# EAGLE schematic RU-PCBA-2X2-001-03 (EAGLE 9.7.0), part 4 of 5
## Sheet 10 of 17: Row 10
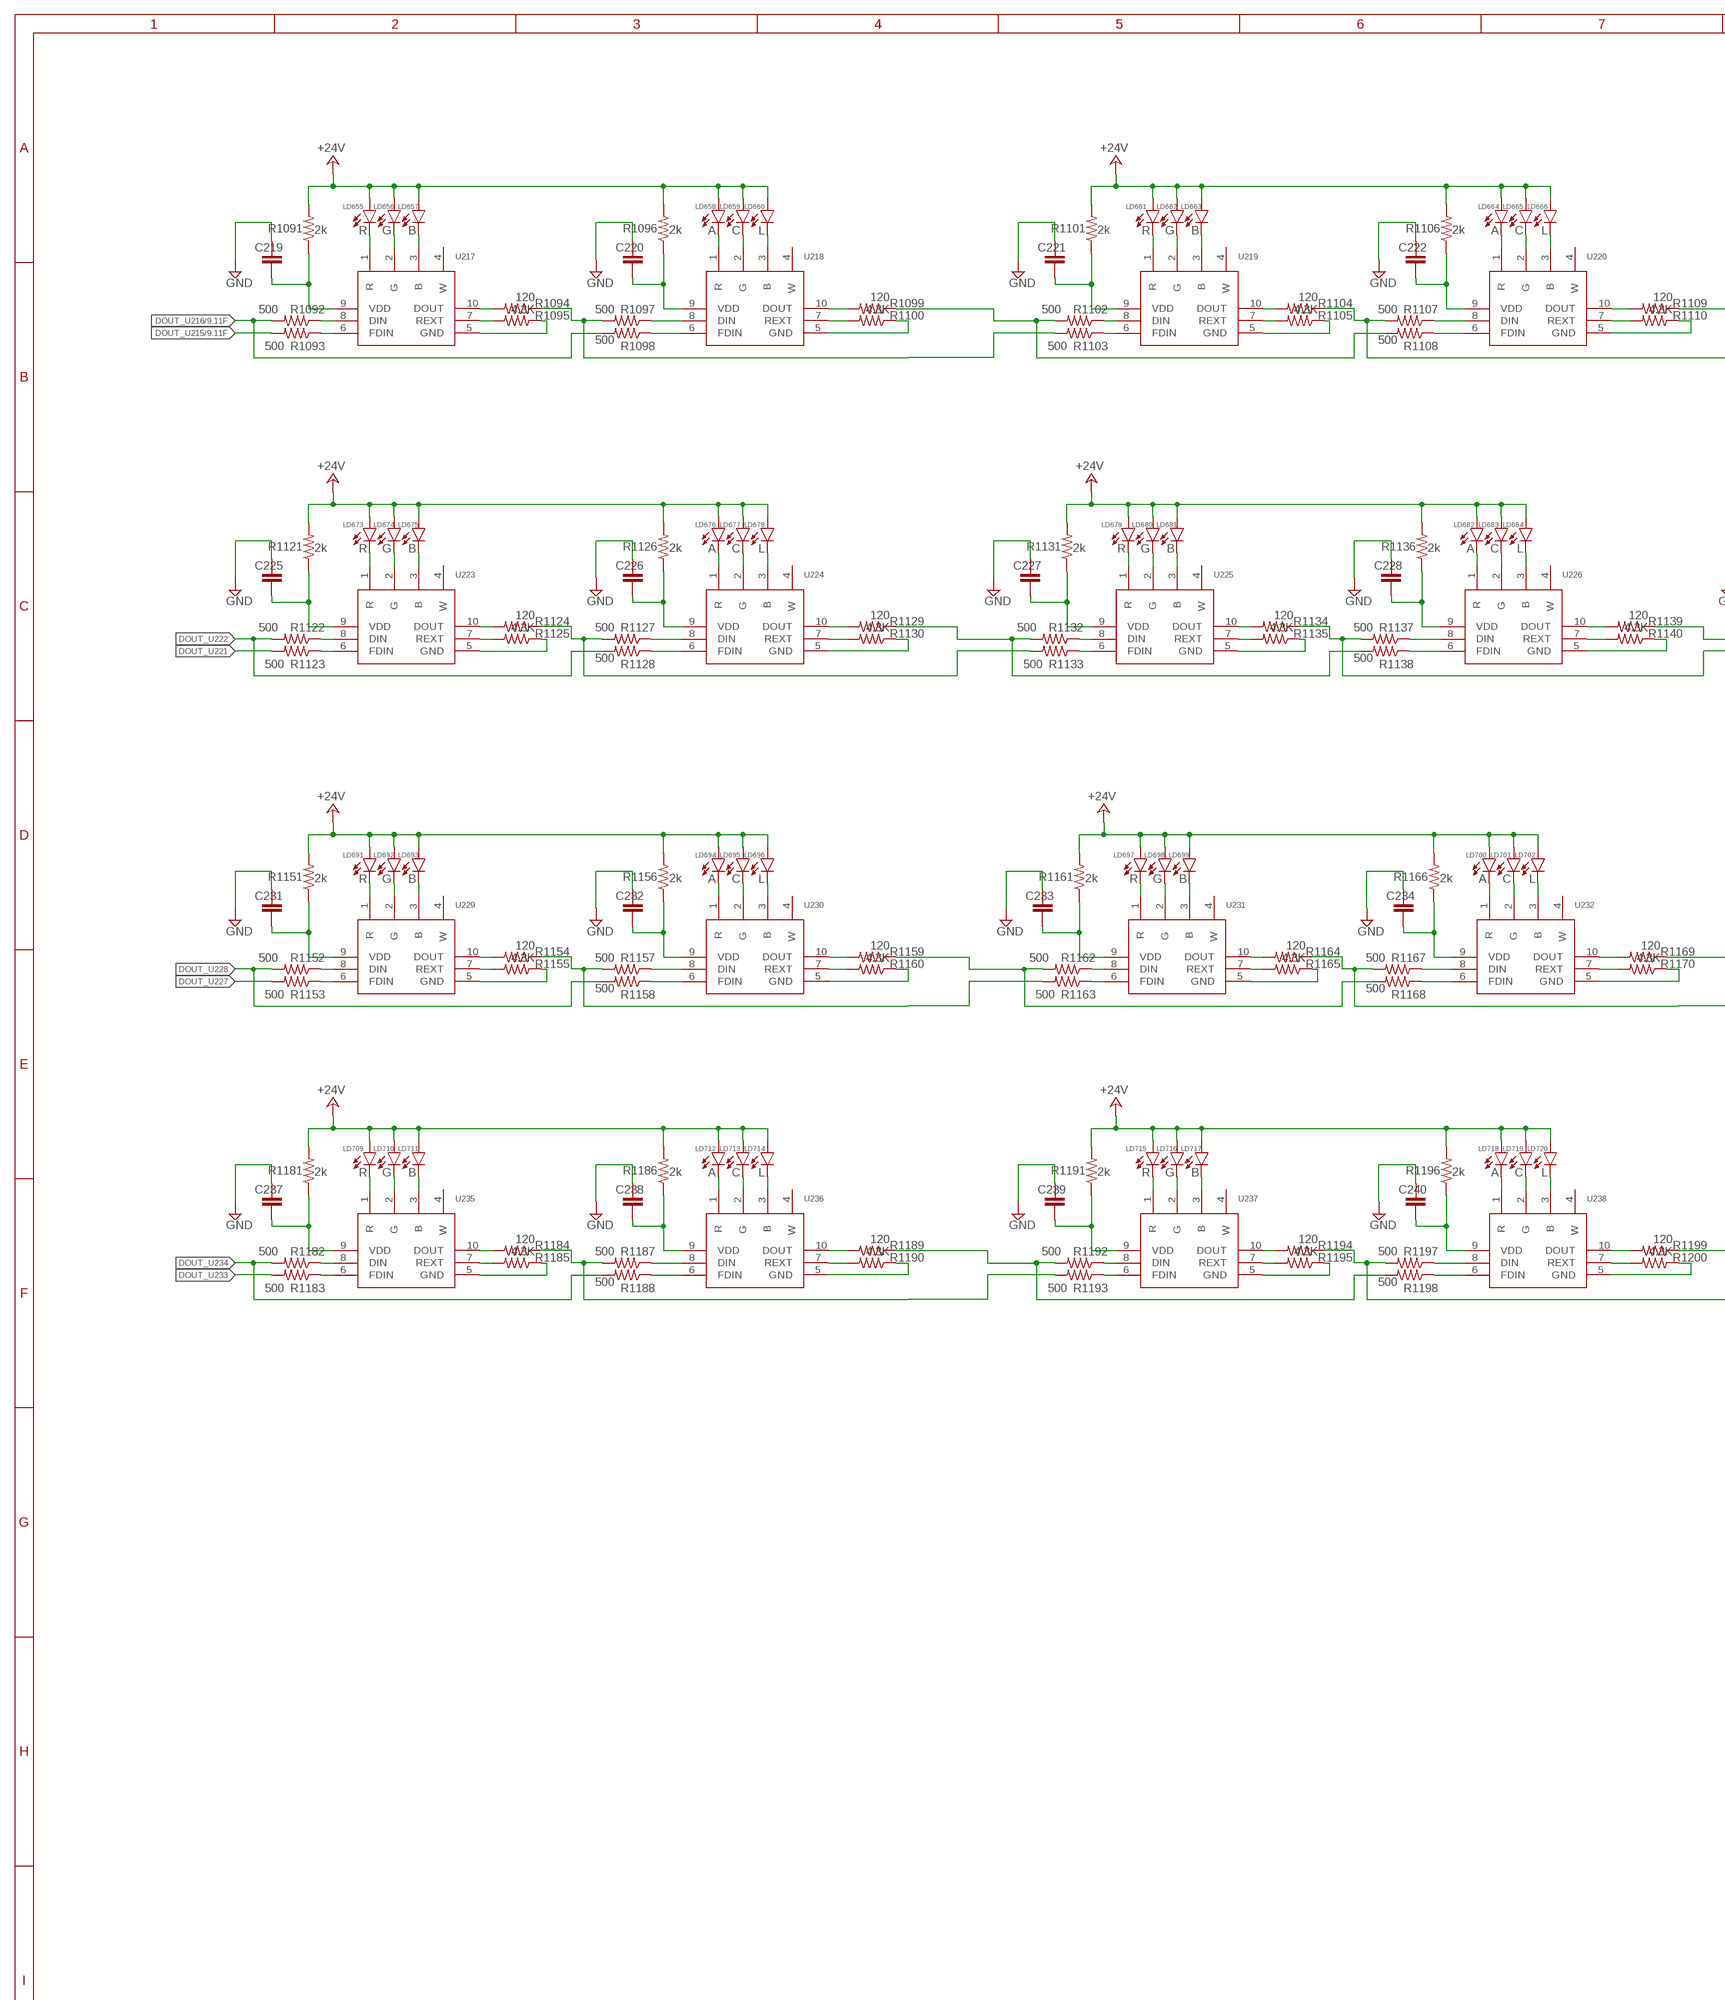
[diagram p18: schematic, sheet 10, part 1 of 2]
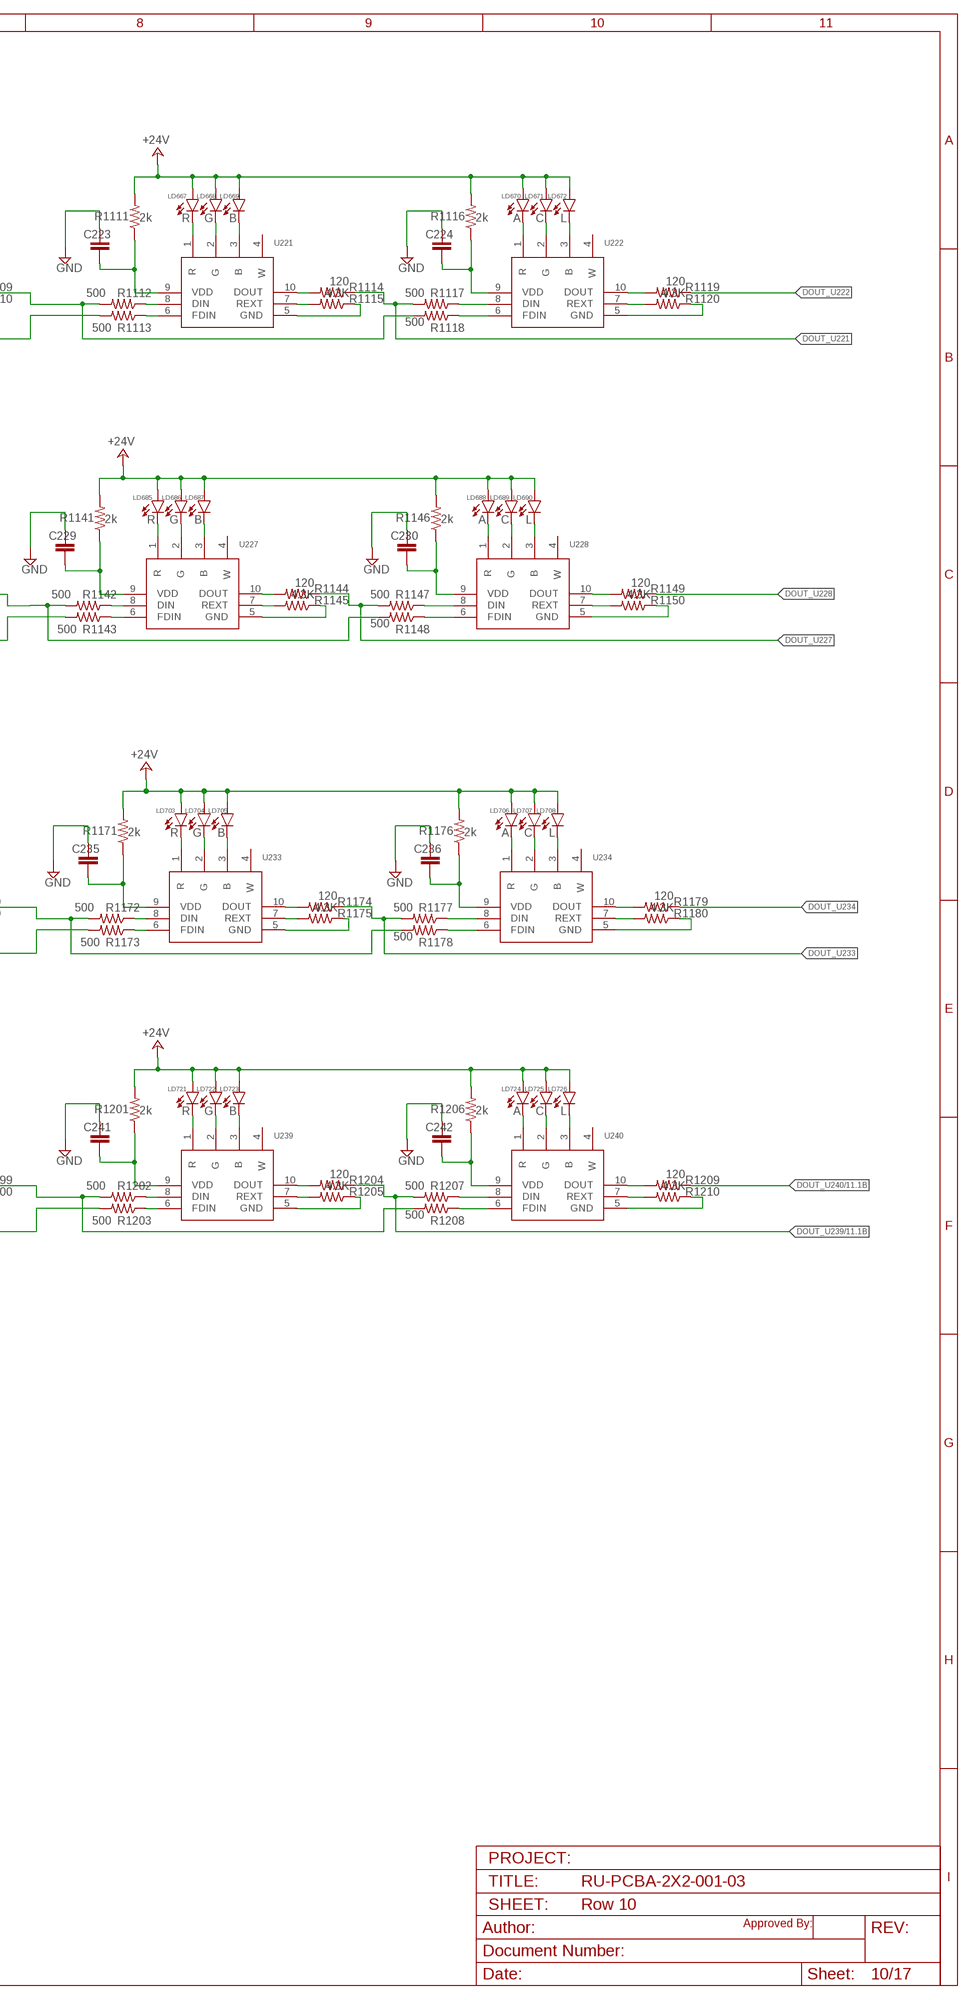
[diagram p19: schematic, sheet 10, part 2 of 2]

### Parts
C219  C-EUC1206  [C1206]
C220  C-EUC1206  [C1206]
C221  C-EUC1206  [C1206]
C222  C-EUC1206  [C1206]
C223  C-EUC1206  [C1206]
C224  C-EUC1206  [C1206]
C225  C-EUC1206  [C1206]
C226  C-EUC1206  [C1206]
C227  C-EUC1206  [C1206]
C228  C-EUC1206  [C1206]
C229  C-EUC1206  [C1206]
C230  C-EUC1206  [C1206]
C231  C-EUC1206  [C1206]
C232  C-EUC1206  [C1206]
C233  C-EUC1206  [C1206]
C234  C-EUC1206  [C1206]
C235  C-EUC1206  [C1206]
C236  C-EUC1206  [C1206]
C237  C-EUC1206  [C1206]
C238  C-EUC1206  [C1206]
C239  C-EUC1206  [C1206]
C240  C-EUC1206  [C1206]
C241  C-EUC1206  [C1206]
C242  C-EUC1206  [C1206]
LD655  R  5050LED  [5050LED]
LD656  G  5050LED  [5050LED]
LD657  B  5050LED  [5050LED]
LD658  A  5050LED  [5050LED]
LD659  C  5050LED  [5050LED]
LD660  L  5050LED  [5050LED]
LD661  R  5050LED  [5050LED]
LD662  G  5050LED  [5050LED]
LD663  B  5050LED  [5050LED]
LD664  A  5050LED  [5050LED]
LD665  C  5050LED  [5050LED]
LD666  L  5050LED  [5050LED]
LD667  R  5050LED  [5050LED]
LD668  G  5050LED  [5050LED]
LD669  B  5050LED  [5050LED]
LD670  A  5050LED  [5050LED]
LD671  C  5050LED  [5050LED]
LD672  L  5050LED  [5050LED]
LD673  R  5050LED  [5050LED]
LD674  G  5050LED  [5050LED]
LD675  B  5050LED  [5050LED]
LD676  A  5050LED  [5050LED]
LD677  C  5050LED  [5050LED]
LD678  L  5050LED  [5050LED]
LD679  R  5050LED  [5050LED]
LD680  G  5050LED  [5050LED]
LD681  B  5050LED  [5050LED]
LD682  A  5050LED  [5050LED]
LD683  C  5050LED  [5050LED]
LD684  L  5050LED  [5050LED]
LD685  R  5050LED  [5050LED]
LD686  G  5050LED  [5050LED]
LD687  B  5050LED  [5050LED]
LD688  A  5050LED  [5050LED]
LD689  C  5050LED  [5050LED]
LD690  L  5050LED  [5050LED]
LD691  R  5050LED  [5050LED]
LD692  G  5050LED  [5050LED]
LD693  B  5050LED  [5050LED]
LD694  A  5050LED  [5050LED]
LD695  C  5050LED  [5050LED]
LD696  L  5050LED  [5050LED]
LD697  R  5050LED  [5050LED]
LD698  G  5050LED  [5050LED]
LD699  B  5050LED  [5050LED]
LD700  A  5050LED  [5050LED]
LD701  C  5050LED  [5050LED]
LD702  L  5050LED  [5050LED]
LD703  R  5050LED  [5050LED]
LD704  G  5050LED  [5050LED]
LD705  B  5050LED  [5050LED]
LD706  A  5050LED  [5050LED]
LD707  C  5050LED  [5050LED]
LD708  L  5050LED  [5050LED]
LD709  R  5050LED  [5050LED]
LD710  G  5050LED  [5050LED]
LD711  B  5050LED  [5050LED]
LD712  A  5050LED  [5050LED]
LD713  C  5050LED  [5050LED]
LD714  L  5050LED  [5050LED]
LD715  R  5050LED  [5050LED]
LD716  G  5050LED  [5050LED]
LD717  B  5050LED  [5050LED]
LD718  A  5050LED  [5050LED]
LD719  C  5050LED  [5050LED]
LD720  L  5050LED  [5050LED]
LD721  R  5050LED  [5050LED]
LD722  G  5050LED  [5050LED]
LD723  B  5050LED  [5050LED]
LD724  A  5050LED  [5050LED]
LD725  C  5050LED  [5050LED]
LD726  L  5050LED  [5050LED]
R1091  2k  R-US_R1206  [R1206]
R1092  500  R-US_R0805  [R0805]
R1093  500  R-US_R0805  [R0805]
R1094  120  R-US_R0805  [R0805]
R1095  4.3K  R-US_R0805  [R0805]
R1096  2k  R-US_R1206  [R1206]
R1097  500  R-US_R0805  [R0805]
R1098  500  R-US_R0805  [R0805]
R1099  120  R-US_R0805  [R0805]
R1100  4.3K  R-US_R0805  [R0805]
R1101  2k  R-US_R1206  [R1206]
R1102  500  R-US_R0805  [R0805]
R1103  500  R-US_R0805  [R0805]
R1104  120  R-US_R0805  [R0805]
R1105  4.3K  R-US_R0805  [R0805]
R1106  2k  R-US_R1206  [R1206]
R1107  500  R-US_R0805  [R0805]
R1108  500  R-US_R0805  [R0805]
R1109  120  R-US_R0805  [R0805]
R1110  4.3K  R-US_R0805  [R0805]
R1111  2k  R-US_R1206  [R1206]
R1112  500  R-US_R0805  [R0805]
R1113  500  R-US_R0805  [R0805]
R1114  120  R-US_R0805  [R0805]
R1115  4.3K  R-US_R0805  [R0805]
R1116  2k  R-US_R1206  [R1206]
R1117  500  R-US_R0805  [R0805]
R1118  500  R-US_R0805  [R0805]
R1119  120  R-US_R0805  [R0805]
R1120  4.3K  R-US_R0805  [R0805]
R1121  2k  R-US_R1206  [R1206]
R1122  500  R-US_R0805  [R0805]
R1123  500  R-US_R0805  [R0805]
R1124  120  R-US_R0805  [R0805]
R1125  4.3K  R-US_R0805  [R0805]
R1126  2k  R-US_R1206  [R1206]
R1127  500  R-US_R0805  [R0805]
R1128  500  R-US_R0805  [R0805]
R1129  120  R-US_R0805  [R0805]
R1130  4.3K  R-US_R0805  [R0805]
R1131  2k  R-US_R1206  [R1206]
R1132  500  R-US_R0805  [R0805]
R1133  500  R-US_R0805  [R0805]
R1134  120  R-US_R0805  [R0805]
R1135  4.3K  R-US_R0805  [R0805]
R1136  2k  R-US_R1206  [R1206]
R1137  500  R-US_R0805  [R0805]
R1138  500  R-US_R0805  [R0805]
R1139  120  R-US_R0805  [R0805]
R1140  4.3K  R-US_R0805  [R0805]
R1141  2k  R-US_R1206  [R1206]
R1142  500  R-US_R0805  [R0805]
R1143  500  R-US_R0805  [R0805]
R1144  120  R-US_R0805  [R0805]
R1145  4.3K  R-US_R0805  [R0805]
R1146  2k  R-US_R1206  [R1206]
R1147  500  R-US_R0805  [R0805]
R1148  500  R-US_R0805  [R0805]
R1149  120  R-US_R0805  [R0805]
R1150  4.3K  R-US_R0805  [R0805]
R1151  2k  R-US_R1206  [R1206]
R1152  500  R-US_R0805  [R0805]
R1153  500  R-US_R0805  [R0805]
R1154  120  R-US_R0805  [R0805]
R1155  4.3K  R-US_R0805  [R0805]
R1156  2k  R-US_R1206  [R1206]
R1157  500  R-US_R0805  [R0805]
R1158  500  R-US_R0805  [R0805]
R1159  120  R-US_R0805  [R0805]
R1160  4.3K  R-US_R0805  [R0805]
R1161  2k  R-US_R1206  [R1206]
R1162  500  R-US_R0805  [R0805]
R1163  500  R-US_R0805  [R0805]
R1164  120  R-US_R0805  [R0805]
R1165  4.3K  R-US_R0805  [R0805]
R1166  2k  R-US_R1206  [R1206]
R1167  500  R-US_R0805  [R0805]
R1168  500  R-US_R0805  [R0805]
R1169  120  R-US_R0805  [R0805]
R1170  4.3K  R-US_R0805  [R0805]
R1171  2k  R-US_R1206  [R1206]
R1172  500  R-US_R0805  [R0805]
R1173  500  R-US_R0805  [R0805]
R1174  120  R-US_R0805  [R0805]
R1175  4.3K  R-US_R0805  [R0805]
R1176  2k  R-US_R1206  [R1206]
R1177  500  R-US_R0805  [R0805]
R1178  500  R-US_R0805  [R0805]
R1179  120  R-US_R0805  [R0805]
R1180  4.3K  R-US_R0805  [R0805]
R1181  2k  R-US_R1206  [R1206]
R1182  500  R-US_R0805  [R0805]
R1183  500  R-US_R0805  [R0805]
R1184  120  R-US_R0805  [R0805]
R1185  4.3K  R-US_R0805  [R0805]
R1186  2k  R-US_R1206  [R1206]
R1187  500  R-US_R0805  [R0805]
R1188  500  R-US_R0805  [R0805]
R1189  120  R-US_R0805  [R0805]
R1190  4.3K  R-US_R0805  [R0805]
R1191  2k  R-US_R1206  [R1206]
R1192  500  R-US_R0805  [R0805]
R1193  500  R-US_R0805  [R0805]
R1194  120  R-US_R0805  [R0805]
R1195  4.3K  R-US_R0805  [R0805]
R1196  2k  R-US_R1206  [R1206]
R1197  500  R-US_R0805  [R0805]
R1198  500  R-US_R0805  [R0805]
R1199  120  R-US_R0805  [R0805]
R1200  4.3K  R-US_R0805  [R0805]
R1201  2k  R-US_R1206  [R1206]
R1202  500  R-US_R0805  [R0805]
R1203  500  R-US_R0805  [R0805]
R1204  120  R-US_R0805  [R0805]
R1205  4.3K  R-US_R0805  [R0805]
R1206  2k  R-US_R1206  [R1206]
R1207  500  R-US_R0805  [R0805]
R1208  500  R-US_R0805  [R0805]
R1209  120  R-US_R0805  [R0805]
R1210  4.3K  R-US_R0805  [R0805]
U217  UCS7604  [SOP100P600X175-10N]
U218  UCS7604  [SOP100P600X175-10N]
U219  UCS7604  [SOP100P600X175-10N]
U220  UCS7604  [SOP100P600X175-10N]
U221  UCS7604  [SOP100P600X175-10N]
U222  UCS7604  [SOP100P600X175-10N]
U223  UCS7604  [SOP100P600X175-10N]
U224  UCS7604  [SOP100P600X175-10N]
U225  UCS7604  [SOP100P600X175-10N]
U226  UCS7604  [SOP100P600X175-10N]
U227  UCS7604  [SOP100P600X175-10N]
U228  UCS7604  [SOP100P600X175-10N]
U229  UCS7604  [SOP100P600X175-10N]
U230  UCS7604  [SOP100P600X175-10N]
U231  UCS7604  [SOP100P600X175-10N]
U232  UCS7604  [SOP100P600X175-10N]
U233  UCS7604  [SOP100P600X175-10N]
U234  UCS7604  [SOP100P600X175-10N]
U235  UCS7604  [SOP100P600X175-10N]
U236  UCS7604  [SOP100P600X175-10N]
U237  UCS7604  [SOP100P600X175-10N]
U238  UCS7604  [SOP100P600X175-10N]
U239  UCS7604  [SOP100P600X175-10N]
U240  UCS7604  [SOP100P600X175-10N]

### Nets
+24V: LD655.A LD656.A LD657.A LD658.A LD659.A LD660.A LD661.A LD662.A LD663.A LD664.A LD665.A LD666.A LD667.A LD668.A LD669.A LD670.A LD671.A LD672.A LD673.A LD674.A LD675.A LD676.A LD677.A LD678.A LD679.A LD680.A LD681.A LD682.A LD683.A LD684.A LD685.A LD686.A LD687.A LD688.A LD689.A LD690.A LD691.A LD692.A LD693.A LD694.A LD695.A LD696.A LD697.A LD698.A LD699.A LD700.A LD701.A LD702.A LD703.A LD704.A LD705.A LD706.A LD707.A LD708.A LD709.A LD710.A LD711.A LD712.A LD713.A LD714.A LD715.A LD716.A LD717.A LD718.A LD719.A LD720.A LD721.A LD722.A LD723.A LD724.A LD725.A LD726.A R1091.2 R1096.2 R1101.2 R1106.2 R1111.2 R1116.2 R1121.2 R1126.2 R1131.2 R1136.2 R1141.2 R1146.2 R1151.2 R1156.2 R1161.2 R1166.2 R1171.2 R1176.2 R1181.2 R1186.2 R1191.2 R1196.2 R1201.2 R1206.2 ; also sheet 1,2,3,4,5,6,7,8,9,11,12,13,14
DOUT_U215: R1093.2 ; also sheet 9
DOUT_U216: R1092.2 R1098.2 ; also sheet 9
DOUT_U221: R1114.1 R1117.2 R1123.2
DOUT_U222: R1119.1 R1122.2 R1128.2
DOUT_U227: R1144.1 R1147.2 R1153.2
DOUT_U228: R1149.1 R1152.2 R1158.2
DOUT_U233: R1174.1 R1177.2 R1183.2
DOUT_U234: R1179.1 R1182.2 R1188.2
DOUT_U239: R1204.1 R1207.2 ; also sheet 11
DOUT_U240: R1209.1 ; also sheet 11
GND: C219.2 C220.2 C221.2 C222.2 C223.2 C224.2 C225.2 C226.2 C227.2 C228.2 C229.2 C230.2 C231.2 C232.2 C233.2 C234.2 C235.2 C236.2 C237.2 C238.2 C239.2 C240.2 C241.2 C242.2 R1095.1 R1100.1 R1105.1 R1110.1 R1115.1 R1120.1 R1125.1 R1130.1 R1135.1 R1140.1 R1145.1 R1150.1 R1155.1 R1160.1 R1165.1 R1170.1 R1175.1 R1180.1 R1185.1 R1190.1 R1195.1 R1200.1 R1205.1 R1210.1 U217.5(GND) U218.5(GND) U219.5(GND) U220.5(GND) U221.5(GND) U222.5(GND) U223.5(GND) U224.5(GND) U225.5(GND) U226.5(GND) U227.5(GND) U228.5(GND) U229.5(GND) U230.5(GND) U231.5(GND) U232.5(GND) U233.5(GND) U234.5(GND) U235.5(GND) U236.5(GND) U237.5(GND) U238.5(GND) U239.5(GND) U240.5(GND) ; also sheet 1,2,3,4,5,6,7,8,9,11,12,13,14
N$2177: C219.1 R1091.1 U217.9(VDD)
N$2178: LD655.K(C) U217.1(R)
N$2179: LD656.K(C) U217.2(G)
N$2180: LD657.K(C) U217.3(B)
N$2181: R1092.1 U217.8(DIN)
N$2182: R1093.1 U217.6(FDIN)
N$2183: R1094.2 U217.10(DOUT)
N$2184: R1095.2 U217.7(REXT)
N$2185: LD658.K(C) U218.1(R)
N$2186: LD659.K(C) U218.2(G)
N$2187: LD660.K(C) U218.3(B)
N$2188: C220.1 R1096.1 U218.9(VDD)
N$2189: R1097.1 U218.8(DIN)
N$2191: R1098.1 U218.6(FDIN)
N$2194: R1099.2 U218.10(DOUT)
N$2195: R1100.2 U218.7(REXT)
N$2196: R1099.1 R1102.2 R1108.2
N$2197: C221.1 R1101.1 U219.9(VDD)
N$2198: LD661.K(C) U219.1(R)
N$2199: LD662.K(C) U219.2(G)
N$2200: LD663.K(C) U219.3(B)
N$2201: R1102.1 U219.8(DIN)
N$2202: R1103.1 U219.6(FDIN)
N$2203: R1104.2 U219.10(DOUT)
N$2204: R1105.2 U219.7(REXT)
N$2205: LD664.K(C) U220.1(R)
N$2206: LD665.K(C) U220.2(G)
N$2207: LD666.K(C) U220.3(B)
N$2208: C222.1 R1106.1 U220.9(VDD)
N$2209: R1107.1 U220.8(DIN)
N$2211: R1108.1 U220.6(FDIN)
N$2213: R1094.1 R1097.2 R1103.2
N$2214: R1109.2 U220.10(DOUT)
N$2215: R1110.2 U220.7(REXT)
N$2216: R1109.1 R1112.2 R1118.2
N$2217: C223.1 R1111.1 U221.9(VDD)
N$2218: LD667.K(C) U221.1(R)
N$2219: LD668.K(C) U221.2(G)
N$2220: LD669.K(C) U221.3(B)
N$2221: R1112.1 U221.8(DIN)
N$2222: R1113.1 U221.6(FDIN)
N$2223: R1114.2 U221.10(DOUT)
N$2224: R1115.2 U221.7(REXT)
N$2225: LD670.K(C) U222.1(R)
N$2226: LD671.K(C) U222.2(G)
N$2227: LD672.K(C) U222.3(B)
N$2228: C224.1 R1116.1 U222.9(VDD)
N$2229: R1117.1 U222.8(DIN)
N$2231: R1118.1 U222.6(FDIN)
N$2233: R1104.1 R1107.2 R1113.2
N$2234: R1119.2 U222.10(DOUT)
N$2235: R1120.2 U222.7(REXT)
N$2237: C225.1 R1121.1 U223.9(VDD)
N$2238: LD673.K(C) U223.1(R)
N$2239: LD674.K(C) U223.2(G)
N$2240: LD675.K(C) U223.3(B)
N$2241: R1122.1 U223.8(DIN)
N$2242: R1123.1 U223.6(FDIN)
N$2243: R1124.2 U223.10(DOUT)
N$2244: R1125.2 U223.7(REXT)
N$2245: LD676.K(C) U224.1(R)
N$2246: LD677.K(C) U224.2(G)
N$2247: LD678.K(C) U224.3(B)
N$2248: C226.1 R1126.1 U224.9(VDD)
N$2249: R1127.1 U224.8(DIN)
N$2251: R1128.1 U224.6(FDIN)
N$2254: R1129.2 U224.10(DOUT)
N$2255: R1130.2 U224.7(REXT)
N$2256: R1129.1 R1132.2 R1138.2
N$2257: C227.1 R1131.1 U225.9(VDD)
N$2258: LD679.K(C) U225.1(R)
N$2259: LD680.K(C) U225.2(G)
N$2260: LD681.K(C) U225.3(B)
N$2261: R1132.1 U225.8(DIN)
N$2262: R1133.1 U225.6(FDIN)
N$2263: R1134.2 U225.10(DOUT)
N$2264: R1135.2 U225.7(REXT)
N$2265: LD682.K(C) U226.1(R)
N$2266: LD683.K(C) U226.2(G)
N$2267: LD684.K(C) U226.3(B)
N$2268: C228.1 R1136.1 U226.9(VDD)
N$2269: R1137.1 U226.8(DIN)
N$2271: R1138.1 U226.6(FDIN)
N$2273: R1124.1 R1127.2 R1133.2
N$2274: R1139.2 U226.10(DOUT)
N$2275: R1140.2 U226.7(REXT)
N$2276: R1139.1 R1142.2 R1148.2
N$2277: C229.1 R1141.1 U227.9(VDD)
N$2278: LD685.K(C) U227.1(R)
N$2279: LD686.K(C) U227.2(G)
N$2280: LD687.K(C) U227.3(B)
N$2281: R1142.1 U227.8(DIN)
N$2282: R1143.1 U227.6(FDIN)
N$2283: R1144.2 U227.10(DOUT)
N$2284: R1145.2 U227.7(REXT)
N$2285: LD688.K(C) U228.1(R)
N$2286: LD689.K(C) U228.2(G)
N$2287: LD690.K(C) U228.3(B)
N$2288: C230.1 R1146.1 U228.9(VDD)
N$2289: R1147.1 U228.8(DIN)
N$2291: R1148.1 U228.6(FDIN)
N$2293: R1134.1 R1137.2 R1143.2
N$2294: R1149.2 U228.10(DOUT)
N$2295: R1150.2 U228.7(REXT)
N$2297: C231.1 R1151.1 U229.9(VDD)
N$2298: LD691.K(C) U229.1(R)
N$2299: LD692.K(C) U229.2(G)
N$2300: LD693.K(C) U229.3(B)
N$2301: R1152.1 U229.8(DIN)
N$2302: R1153.1 U229.6(FDIN)
N$2303: R1154.2 U229.10(DOUT)
N$2304: R1155.2 U229.7(REXT)
N$2305: LD694.K(C) U230.1(R)
N$2306: LD695.K(C) U230.2(G)
N$2307: LD696.K(C) U230.3(B)
N$2308: C232.1 R1156.1 U230.9(VDD)
N$2309: R1157.1 U230.8(DIN)
N$2311: R1158.1 U230.6(FDIN)
N$2314: R1159.2 U230.10(DOUT)
N$2315: R1160.2 U230.7(REXT)
N$2316: R1159.1 R1162.2 R1168.2
N$2317: C233.1 R1161.1 U231.9(VDD)
N$2318: LD697.K(C) U231.1(R)
N$2319: LD698.K(C) U231.2(G)
N$2320: LD699.K(C) U231.3(B)
N$2321: R1162.1 U231.8(DIN)
N$2322: R1163.1 U231.6(FDIN)
N$2323: R1164.2 U231.10(DOUT)
N$2324: R1165.2 U231.7(REXT)
N$2325: LD700.K(C) U232.1(R)
N$2326: LD701.K(C) U232.2(G)
N$2327: LD702.K(C) U232.3(B)
N$2328: C234.1 R1166.1 U232.9(VDD)
N$2329: R1167.1 U232.8(DIN)
N$2331: R1168.1 U232.6(FDIN)
N$2333: R1154.1 R1157.2 R1163.2
N$2334: R1169.2 U232.10(DOUT)
N$2335: R1170.2 U232.7(REXT)
N$2336: R1169.1 R1172.2 R1178.2
N$2337: C235.1 R1171.1 U233.9(VDD)
N$2338: LD703.K(C) U233.1(R)
N$2339: LD704.K(C) U233.2(G)
N$2340: LD705.K(C) U233.3(B)
N$2341: R1172.1 U233.8(DIN)
N$2342: R1173.1 U233.6(FDIN)
N$2343: R1174.2 U233.10(DOUT)
N$2344: R1175.2 U233.7(REXT)
N$2345: LD706.K(C) U234.1(R)
N$2346: LD707.K(C) U234.2(G)
N$2347: LD708.K(C) U234.3(B)
N$2348: C236.1 R1176.1 U234.9(VDD)
N$2349: R1177.1 U234.8(DIN)
N$2351: R1178.1 U234.6(FDIN)
N$2353: R1164.1 R1167.2 R1173.2
N$2354: R1179.2 U234.10(DOUT)
N$2355: R1180.2 U234.7(REXT)
N$2357: C237.1 R1181.1 U235.9(VDD)
N$2358: LD709.K(C) U235.1(R)
N$2359: LD710.K(C) U235.2(G)
N$2360: LD711.K(C) U235.3(B)
N$2361: R1182.1 U235.8(DIN)
N$2362: R1183.1 U235.6(FDIN)
N$2363: R1184.2 U235.10(DOUT)
N$2364: R1185.2 U235.7(REXT)
N$2365: LD712.K(C) U236.1(R)
N$2366: LD713.K(C) U236.2(G)
N$2367: LD714.K(C) U236.3(B)
N$2368: C238.1 R1186.1 U236.9(VDD)
N$2369: R1187.1 U236.8(DIN)
N$2371: R1188.1 U236.6(FDIN)
N$2374: R1189.2 U236.10(DOUT)
N$2375: R1190.2 U236.7(REXT)
N$2376: R1189.1 R1192.2 R1198.2
N$2377: C239.1 R1191.1 U237.9(VDD)
N$2378: LD715.K(C) U237.1(R)
N$2379: LD716.K(C) U237.2(G)
N$2380: LD717.K(C) U237.3(B)
N$2381: R1192.1 U237.8(DIN)
N$2382: R1193.1 U237.6(FDIN)
N$2383: R1194.2 U237.10(DOUT)
N$2384: R1195.2 U237.7(REXT)
N$2385: LD718.K(C) U238.1(R)
N$2386: LD719.K(C) U238.2(G)
N$2387: LD720.K(C) U238.3(B)
N$2388: C240.1 R1196.1 U238.9(VDD)
N$2389: R1197.1 U238.8(DIN)
N$2390: R1194.1 R1197.2 R1203.2
N$2391: R1198.1 U238.6(FDIN)
N$2393: R1184.1 R1187.2 R1193.2
N$2394: R1199.2 U238.10(DOUT)
N$2395: R1200.2 U238.7(REXT)
N$2396: R1199.1 R1202.2 R1208.2
N$2397: C241.1 R1201.1 U239.9(VDD)
N$2398: LD721.K(C) U239.1(R)
N$2399: LD722.K(C) U239.2(G)
N$2400: LD723.K(C) U239.3(B)
N$2401: R1202.1 U239.8(DIN)
N$2402: R1203.1 U239.6(FDIN)
N$2403: R1204.2 U239.10(DOUT)
N$2404: R1205.2 U239.7(REXT)
N$2405: LD724.K(C) U240.1(R)
N$2406: LD725.K(C) U240.2(G)
N$2407: LD726.K(C) U240.3(B)
N$2408: C242.1 R1206.1 U240.9(VDD)
N$2409: R1207.1 U240.8(DIN)
N$2411: R1208.1 U240.6(FDIN)
N$2414: R1209.2 U240.10(DOUT)
N$2415: R1210.2 U240.7(REXT)
Unconnected: U217.4(W) U218.4(W) U219.4(W) U220.4(W) U221.4(W) U222.4(W) U223.4(W) U224.4(W) U225.4(W) U226.4(W) U227.4(W) U228.4(W) U229.4(W) U230.4(W) U231.4(W) U232.4(W) U233.4(W) U234.4(W) U235.4(W) U236.4(W) U237.4(W) U238.4(W) U239.4(W) U240.4(W)

## Sheet 11 of 17: Row 11
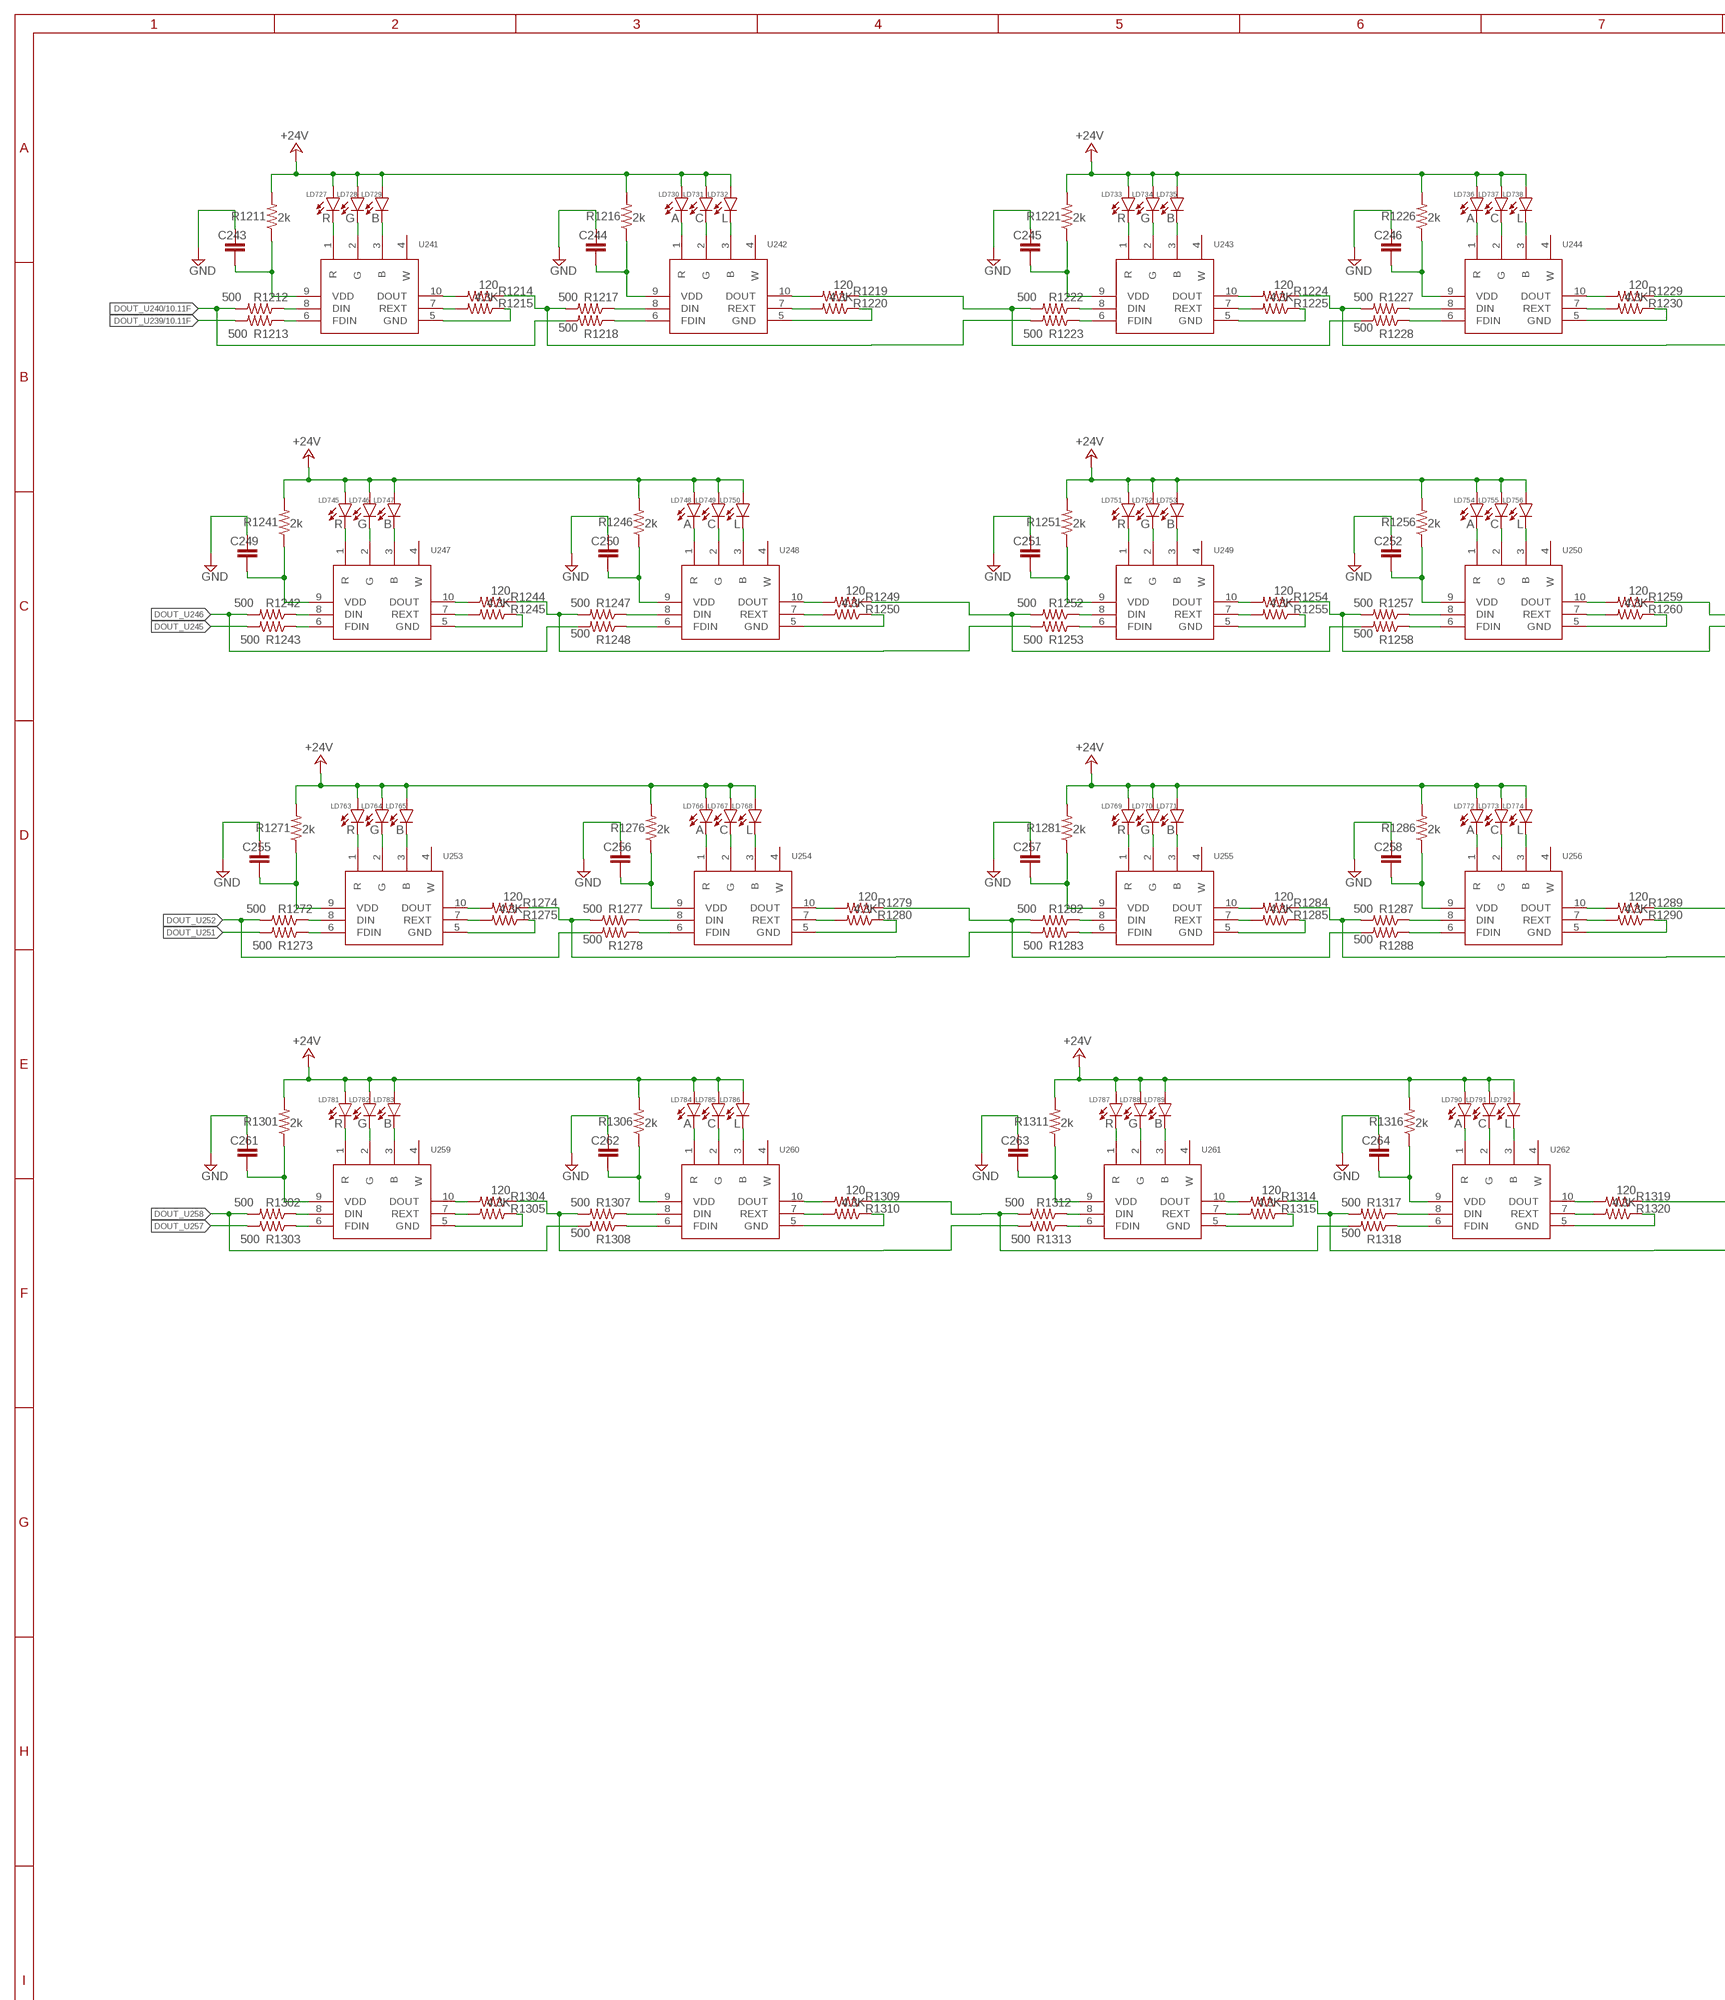
[diagram p20: schematic, sheet 11, part 1 of 2]
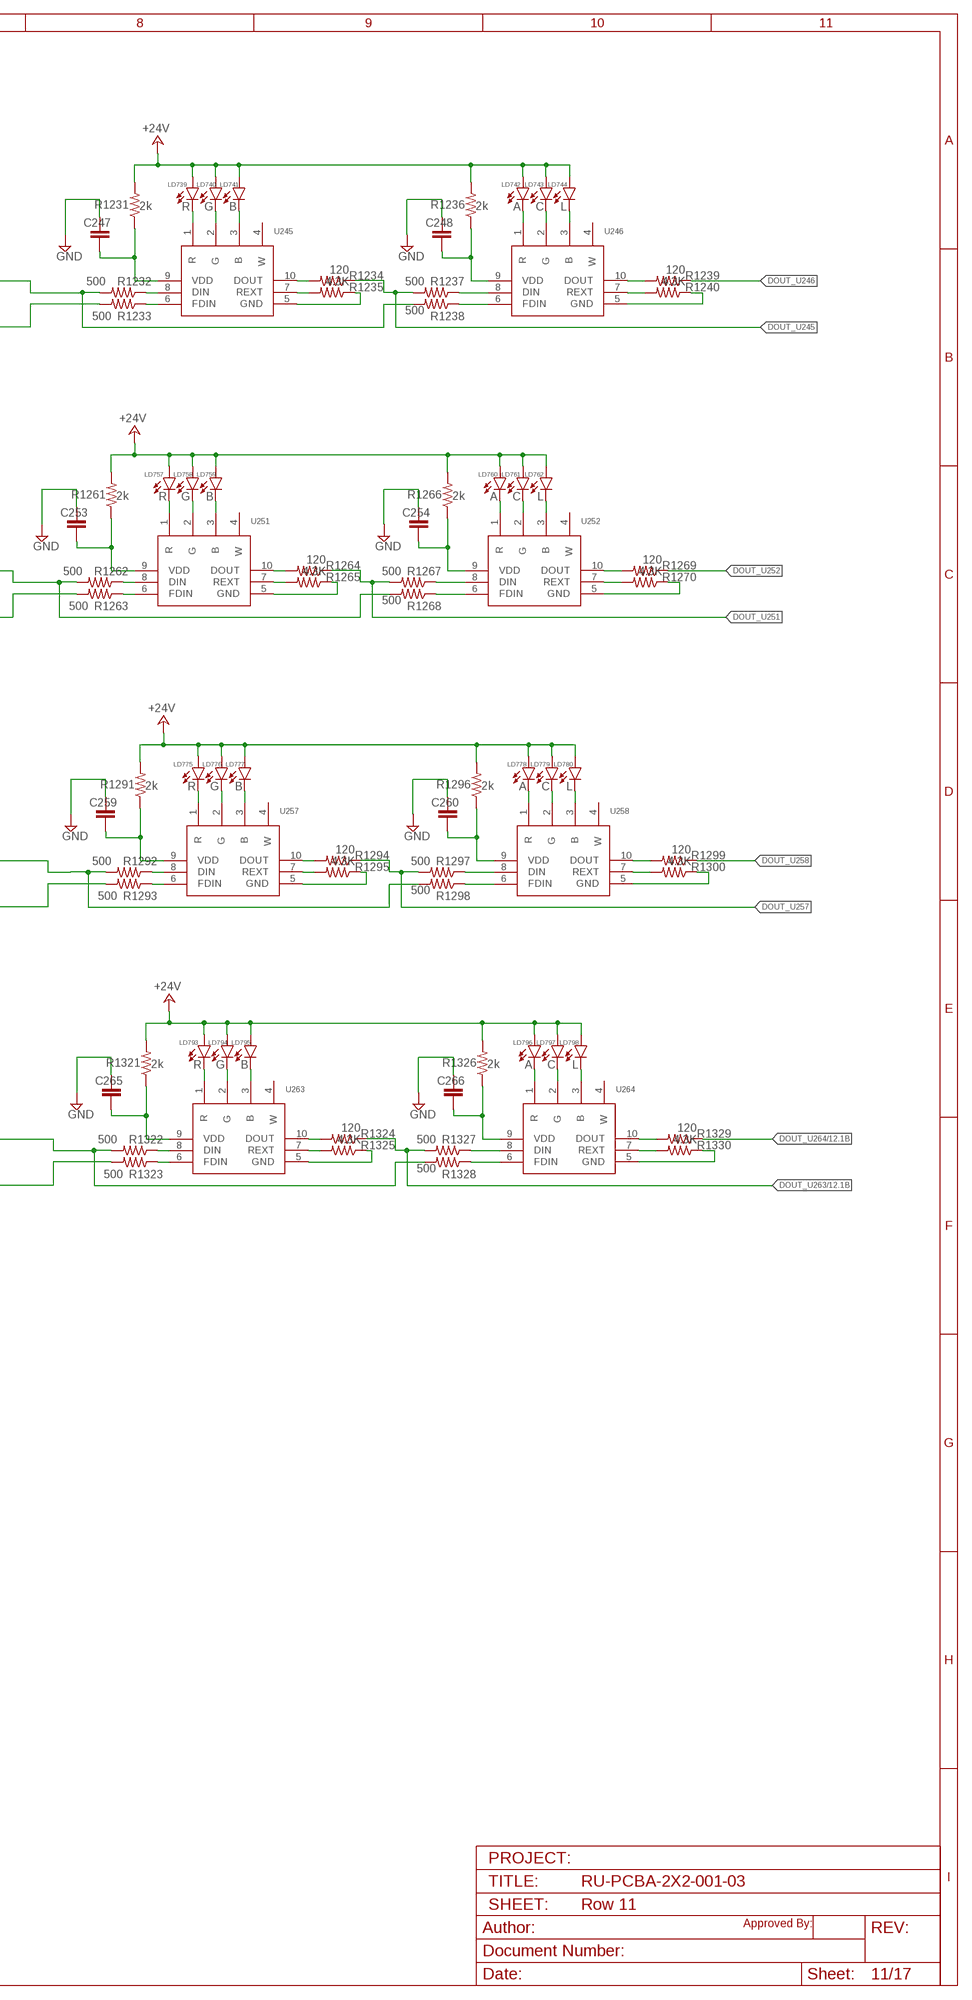
[diagram p21: schematic, sheet 11, part 2 of 2]

### Parts
C243  C-EUC1206  [C1206]
C244  C-EUC1206  [C1206]
C245  C-EUC1206  [C1206]
C246  C-EUC1206  [C1206]
C247  C-EUC1206  [C1206]
C248  C-EUC1206  [C1206]
C249  C-EUC1206  [C1206]
C250  C-EUC1206  [C1206]
C251  C-EUC1206  [C1206]
C252  C-EUC1206  [C1206]
C253  C-EUC1206  [C1206]
C254  C-EUC1206  [C1206]
C255  C-EUC1206  [C1206]
C256  C-EUC1206  [C1206]
C257  C-EUC1206  [C1206]
C258  C-EUC1206  [C1206]
C259  C-EUC1206  [C1206]
C260  C-EUC1206  [C1206]
C261  C-EUC1206  [C1206]
C262  C-EUC1206  [C1206]
C263  C-EUC1206  [C1206]
C264  C-EUC1206  [C1206]
C265  C-EUC1206  [C1206]
C266  C-EUC1206  [C1206]
LD727  R  5050LED  [5050LED]
LD728  G  5050LED  [5050LED]
LD729  B  5050LED  [5050LED]
LD730  A  5050LED  [5050LED]
LD731  C  5050LED  [5050LED]
LD732  L  5050LED  [5050LED]
LD733  R  5050LED  [5050LED]
LD734  G  5050LED  [5050LED]
LD735  B  5050LED  [5050LED]
LD736  A  5050LED  [5050LED]
LD737  C  5050LED  [5050LED]
LD738  L  5050LED  [5050LED]
LD739  R  5050LED  [5050LED]
LD740  G  5050LED  [5050LED]
LD741  B  5050LED  [5050LED]
LD742  A  5050LED  [5050LED]
LD743  C  5050LED  [5050LED]
LD744  L  5050LED  [5050LED]
LD745  R  5050LED  [5050LED]
LD746  G  5050LED  [5050LED]
LD747  B  5050LED  [5050LED]
LD748  A  5050LED  [5050LED]
LD749  C  5050LED  [5050LED]
LD750  L  5050LED  [5050LED]
LD751  R  5050LED  [5050LED]
LD752  G  5050LED  [5050LED]
LD753  B  5050LED  [5050LED]
LD754  A  5050LED  [5050LED]
LD755  C  5050LED  [5050LED]
LD756  L  5050LED  [5050LED]
LD757  R  5050LED  [5050LED]
LD758  G  5050LED  [5050LED]
LD759  B  5050LED  [5050LED]
LD760  A  5050LED  [5050LED]
LD761  C  5050LED  [5050LED]
LD762  L  5050LED  [5050LED]
LD763  R  5050LED  [5050LED]
LD764  G  5050LED  [5050LED]
LD765  B  5050LED  [5050LED]
LD766  A  5050LED  [5050LED]
LD767  C  5050LED  [5050LED]
LD768  L  5050LED  [5050LED]
LD769  R  5050LED  [5050LED]
LD770  G  5050LED  [5050LED]
LD771  B  5050LED  [5050LED]
LD772  A  5050LED  [5050LED]
LD773  C  5050LED  [5050LED]
LD774  L  5050LED  [5050LED]
LD775  R  5050LED  [5050LED]
LD776  G  5050LED  [5050LED]
LD777  B  5050LED  [5050LED]
LD778  A  5050LED  [5050LED]
LD779  C  5050LED  [5050LED]
LD780  L  5050LED  [5050LED]
LD781  R  5050LED  [5050LED]
LD782  G  5050LED  [5050LED]
LD783  B  5050LED  [5050LED]
LD784  A  5050LED  [5050LED]
LD785  C  5050LED  [5050LED]
LD786  L  5050LED  [5050LED]
LD787  R  5050LED  [5050LED]
LD788  G  5050LED  [5050LED]
LD789  B  5050LED  [5050LED]
LD790  A  5050LED  [5050LED]
LD791  C  5050LED  [5050LED]
LD792  L  5050LED  [5050LED]
LD793  R  5050LED  [5050LED]
LD794  G  5050LED  [5050LED]
LD795  B  5050LED  [5050LED]
LD796  A  5050LED  [5050LED]
LD797  C  5050LED  [5050LED]
LD798  L  5050LED  [5050LED]
R1211  2k  R-US_R1206  [R1206]
R1212  500  R-US_R0805  [R0805]
R1213  500  R-US_R0805  [R0805]
R1214  120  R-US_R0805  [R0805]
R1215  4.3K  R-US_R0805  [R0805]
R1216  2k  R-US_R1206  [R1206]
R1217  500  R-US_R0805  [R0805]
R1218  500  R-US_R0805  [R0805]
R1219  120  R-US_R0805  [R0805]
R1220  4.3K  R-US_R0805  [R0805]
R1221  2k  R-US_R1206  [R1206]
R1222  500  R-US_R0805  [R0805]
R1223  500  R-US_R0805  [R0805]
R1224  120  R-US_R0805  [R0805]
R1225  4.3K  R-US_R0805  [R0805]
R1226  2k  R-US_R1206  [R1206]
R1227  500  R-US_R0805  [R0805]
R1228  500  R-US_R0805  [R0805]
R1229  120  R-US_R0805  [R0805]
R1230  4.3K  R-US_R0805  [R0805]
R1231  2k  R-US_R1206  [R1206]
R1232  500  R-US_R0805  [R0805]
R1233  500  R-US_R0805  [R0805]
R1234  120  R-US_R0805  [R0805]
R1235  4.3K  R-US_R0805  [R0805]
R1236  2k  R-US_R1206  [R1206]
R1237  500  R-US_R0805  [R0805]
R1238  500  R-US_R0805  [R0805]
R1239  120  R-US_R0805  [R0805]
R1240  4.3K  R-US_R0805  [R0805]
R1241  2k  R-US_R1206  [R1206]
R1242  500  R-US_R0805  [R0805]
R1243  500  R-US_R0805  [R0805]
R1244  120  R-US_R0805  [R0805]
R1245  4.3K  R-US_R0805  [R0805]
R1246  2k  R-US_R1206  [R1206]
R1247  500  R-US_R0805  [R0805]
R1248  500  R-US_R0805  [R0805]
R1249  120  R-US_R0805  [R0805]
R1250  4.3K  R-US_R0805  [R0805]
R1251  2k  R-US_R1206  [R1206]
R1252  500  R-US_R0805  [R0805]
R1253  500  R-US_R0805  [R0805]
R1254  120  R-US_R0805  [R0805]
R1255  4.3K  R-US_R0805  [R0805]
R1256  2k  R-US_R1206  [R1206]
R1257  500  R-US_R0805  [R0805]
R1258  500  R-US_R0805  [R0805]
R1259  120  R-US_R0805  [R0805]
R1260  4.3K  R-US_R0805  [R0805]
R1261  2k  R-US_R1206  [R1206]
R1262  500  R-US_R0805  [R0805]
R1263  500  R-US_R0805  [R0805]
R1264  120  R-US_R0805  [R0805]
R1265  4.3K  R-US_R0805  [R0805]
R1266  2k  R-US_R1206  [R1206]
R1267  500  R-US_R0805  [R0805]
R1268  500  R-US_R0805  [R0805]
R1269  120  R-US_R0805  [R0805]
R1270  4.3K  R-US_R0805  [R0805]
R1271  2k  R-US_R1206  [R1206]
R1272  500  R-US_R0805  [R0805]
R1273  500  R-US_R0805  [R0805]
R1274  120  R-US_R0805  [R0805]
R1275  4.3K  R-US_R0805  [R0805]
R1276  2k  R-US_R1206  [R1206]
R1277  500  R-US_R0805  [R0805]
R1278  500  R-US_R0805  [R0805]
R1279  120  R-US_R0805  [R0805]
R1280  4.3K  R-US_R0805  [R0805]
R1281  2k  R-US_R1206  [R1206]
R1282  500  R-US_R0805  [R0805]
R1283  500  R-US_R0805  [R0805]
R1284  120  R-US_R0805  [R0805]
R1285  4.3K  R-US_R0805  [R0805]
R1286  2k  R-US_R1206  [R1206]
R1287  500  R-US_R0805  [R0805]
R1288  500  R-US_R0805  [R0805]
R1289  120  R-US_R0805  [R0805]
R1290  4.3K  R-US_R0805  [R0805]
R1291  2k  R-US_R1206  [R1206]
R1292  500  R-US_R0805  [R0805]
R1293  500  R-US_R0805  [R0805]
R1294  120  R-US_R0805  [R0805]
R1295  4.3K  R-US_R0805  [R0805]
R1296  2k  R-US_R1206  [R1206]
R1297  500  R-US_R0805  [R0805]
R1298  500  R-US_R0805  [R0805]
R1299  120  R-US_R0805  [R0805]
R1300  4.3K  R-US_R0805  [R0805]
R1301  2k  R-US_R1206  [R1206]
R1302  500  R-US_R0805  [R0805]
R1303  500  R-US_R0805  [R0805]
R1304  120  R-US_R0805  [R0805]
R1305  4.3K  R-US_R0805  [R0805]
R1306  2k  R-US_R1206  [R1206]
R1307  500  R-US_R0805  [R0805]
R1308  500  R-US_R0805  [R0805]
R1309  120  R-US_R0805  [R0805]
R1310  4.3K  R-US_R0805  [R0805]
R1311  2k  R-US_R1206  [R1206]
R1312  500  R-US_R0805  [R0805]
R1313  500  R-US_R0805  [R0805]
R1314  120  R-US_R0805  [R0805]
R1315  4.3K  R-US_R0805  [R0805]
R1316  2k  R-US_R1206  [R1206]
R1317  500  R-US_R0805  [R0805]
R1318  500  R-US_R0805  [R0805]
R1319  120  R-US_R0805  [R0805]
R1320  4.3K  R-US_R0805  [R0805]
R1321  2k  R-US_R1206  [R1206]
R1322  500  R-US_R0805  [R0805]
R1323  500  R-US_R0805  [R0805]
R1324  120  R-US_R0805  [R0805]
R1325  4.3K  R-US_R0805  [R0805]
R1326  2k  R-US_R1206  [R1206]
R1327  500  R-US_R0805  [R0805]
R1328  500  R-US_R0805  [R0805]
R1329  120  R-US_R0805  [R0805]
R1330  4.3K  R-US_R0805  [R0805]
U241  UCS7604  [SOP100P600X175-10N]
U242  UCS7604  [SOP100P600X175-10N]
U243  UCS7604  [SOP100P600X175-10N]
U244  UCS7604  [SOP100P600X175-10N]
U245  UCS7604  [SOP100P600X175-10N]
U246  UCS7604  [SOP100P600X175-10N]
U247  UCS7604  [SOP100P600X175-10N]
U248  UCS7604  [SOP100P600X175-10N]
U249  UCS7604  [SOP100P600X175-10N]
U250  UCS7604  [SOP100P600X175-10N]
U251  UCS7604  [SOP100P600X175-10N]
U252  UCS7604  [SOP100P600X175-10N]
U253  UCS7604  [SOP100P600X175-10N]
U254  UCS7604  [SOP100P600X175-10N]
U255  UCS7604  [SOP100P600X175-10N]
U256  UCS7604  [SOP100P600X175-10N]
U257  UCS7604  [SOP100P600X175-10N]
U258  UCS7604  [SOP100P600X175-10N]
U259  UCS7604  [SOP100P600X175-10N]
U260  UCS7604  [SOP100P600X175-10N]
U261  UCS7604  [SOP100P600X175-10N]
U262  UCS7604  [SOP100P600X175-10N]
U263  UCS7604  [SOP100P600X175-10N]
U264  UCS7604  [SOP100P600X175-10N]

### Nets
+24V: LD727.A LD728.A LD729.A LD730.A LD731.A LD732.A LD733.A LD734.A LD735.A LD736.A LD737.A LD738.A LD739.A LD740.A LD741.A LD742.A LD743.A LD744.A LD745.A LD746.A LD747.A LD748.A LD749.A LD750.A LD751.A LD752.A LD753.A LD754.A LD755.A LD756.A LD757.A LD758.A LD759.A LD760.A LD761.A LD762.A LD763.A LD764.A LD765.A LD766.A LD767.A LD768.A LD769.A LD770.A LD771.A LD772.A LD773.A LD774.A LD775.A LD776.A LD777.A LD778.A LD779.A LD780.A LD781.A LD782.A LD783.A LD784.A LD785.A LD786.A LD787.A LD788.A LD789.A LD790.A LD791.A LD792.A LD793.A LD794.A LD795.A LD796.A LD797.A LD798.A R1211.2 R1216.2 R1221.2 R1226.2 R1231.2 R1236.2 R1241.2 R1246.2 R1251.2 R1256.2 R1261.2 R1266.2 R1271.2 R1276.2 R1281.2 R1286.2 R1291.2 R1296.2 R1301.2 R1306.2 R1311.2 R1316.2 R1321.2 R1326.2 ; also sheet 1,2,3,4,5,6,7,8,9,10,12,13,14
DOUT_U239: R1213.2 ; also sheet 10
DOUT_U240: R1212.2 R1218.2 ; also sheet 10
DOUT_U245: R1234.1 R1237.2 R1243.2
DOUT_U246: R1239.1 R1242.2 R1248.2
DOUT_U251: R1264.1 R1267.2 R1273.2
DOUT_U252: R1269.1 R1272.2 R1278.2
DOUT_U257: R1294.1 R1297.2 R1303.2
DOUT_U258: R1299.1 R1302.2 R1308.2
DOUT_U263: R1324.1 R1327.2 ; also sheet 12
DOUT_U264: R1329.1 ; also sheet 12
GND: C243.2 C244.2 C245.2 C246.2 C247.2 C248.2 C249.2 C250.2 C251.2 C252.2 C253.2 C254.2 C255.2 C256.2 C257.2 C258.2 C259.2 C260.2 C261.2 C262.2 C263.2 C264.2 C265.2 C266.2 R1215.1 R1220.1 R1225.1 R1230.1 R1235.1 R1240.1 R1245.1 R1250.1 R1255.1 R1260.1 R1265.1 R1270.1 R1275.1 R1280.1 R1285.1 R1290.1 R1295.1 R1300.1 R1305.1 R1310.1 R1315.1 R1320.1 R1325.1 R1330.1 U241.5(GND) U242.5(GND) U243.5(GND) U244.5(GND) U245.5(GND) U246.5(GND) U247.5(GND) U248.5(GND) U249.5(GND) U250.5(GND) U251.5(GND) U252.5(GND) U253.5(GND) U254.5(GND) U255.5(GND) U256.5(GND) U257.5(GND) U258.5(GND) U259.5(GND) U260.5(GND) U261.5(GND) U262.5(GND) U263.5(GND) U264.5(GND) ; also sheet 1,2,3,4,5,6,7,8,9,10,12,13,14
N$2417: C243.1 R1211.1 U241.9(VDD)
N$2418: LD727.K(C) U241.1(R)
N$2419: LD728.K(C) U241.2(G)
N$2420: LD729.K(C) U241.3(B)
N$2421: R1212.1 U241.8(DIN)
N$2422: R1213.1 U241.6(FDIN)
N$2423: R1214.2 U241.10(DOUT)
N$2424: R1215.2 U241.7(REXT)
N$2425: LD730.K(C) U242.1(R)
N$2426: LD731.K(C) U242.2(G)
N$2427: LD732.K(C) U242.3(B)
N$2428: C244.1 R1216.1 U242.9(VDD)
N$2429: R1217.1 U242.8(DIN)
N$2431: R1218.1 U242.6(FDIN)
N$2434: R1219.2 U242.10(DOUT)
N$2435: R1220.2 U242.7(REXT)
N$2436: R1219.1 R1222.2 R1228.2
N$2437: C245.1 R1221.1 U243.9(VDD)
N$2438: LD733.K(C) U243.1(R)
N$2439: LD734.K(C) U243.2(G)
N$2440: LD735.K(C) U243.3(B)
N$2441: R1222.1 U243.8(DIN)
N$2442: R1223.1 U243.6(FDIN)
N$2443: R1224.2 U243.10(DOUT)
N$2444: R1225.2 U243.7(REXT)
N$2445: LD736.K(C) U244.1(R)
N$2446: LD737.K(C) U244.2(G)
N$2447: LD738.K(C) U244.3(B)
N$2448: C246.1 R1226.1 U244.9(VDD)
N$2449: R1227.1 U244.8(DIN)
N$2451: R1228.1 U244.6(FDIN)
N$2453: R1214.1 R1217.2 R1223.2
N$2454: R1229.2 U244.10(DOUT)
N$2455: R1230.2 U244.7(REXT)
N$2456: R1229.1 R1232.2 R1238.2
N$2457: C247.1 R1231.1 U245.9(VDD)
N$2458: LD739.K(C) U245.1(R)
N$2459: LD740.K(C) U245.2(G)
N$2460: LD741.K(C) U245.3(B)
N$2461: R1232.1 U245.8(DIN)
N$2462: R1233.1 U245.6(FDIN)
N$2463: R1234.2 U245.10(DOUT)
N$2464: R1235.2 U245.7(REXT)
N$2465: LD742.K(C) U246.1(R)
N$2466: LD743.K(C) U246.2(G)
N$2467: LD744.K(C) U246.3(B)
N$2468: C248.1 R1236.1 U246.9(VDD)
N$2469: R1237.1 U246.8(DIN)
N$2471: R1238.1 U246.6(FDIN)
N$2473: R1224.1 R1227.2 R1233.2
N$2474: R1239.2 U246.10(DOUT)
N$2475: R1240.2 U246.7(REXT)
N$2477: C249.1 R1241.1 U247.9(VDD)
N$2478: LD745.K(C) U247.1(R)
N$2479: LD746.K(C) U247.2(G)
N$2480: LD747.K(C) U247.3(B)
N$2481: R1242.1 U247.8(DIN)
N$2482: R1243.1 U247.6(FDIN)
N$2483: R1244.2 U247.10(DOUT)
N$2484: R1245.2 U247.7(REXT)
N$2485: LD748.K(C) U248.1(R)
N$2486: LD749.K(C) U248.2(G)
N$2487: LD750.K(C) U248.3(B)
N$2488: C250.1 R1246.1 U248.9(VDD)
N$2489: R1247.1 U248.8(DIN)
N$2491: R1248.1 U248.6(FDIN)
N$2494: R1249.2 U248.10(DOUT)
N$2495: R1250.2 U248.7(REXT)
N$2496: R1249.1 R1252.2 R1258.2
N$2497: C251.1 R1251.1 U249.9(VDD)
N$2498: LD751.K(C) U249.1(R)
N$2499: LD752.K(C) U249.2(G)
N$2500: LD753.K(C) U249.3(B)
N$2501: R1252.1 U249.8(DIN)
N$2502: R1253.1 U249.6(FDIN)
N$2503: R1254.2 U249.10(DOUT)
N$2504: R1255.2 U249.7(REXT)
N$2505: LD754.K(C) U250.1(R)
N$2506: LD755.K(C) U250.2(G)
N$2507: LD756.K(C) U250.3(B)
N$2508: C252.1 R1256.1 U250.9(VDD)
N$2509: R1257.1 U250.8(DIN)
N$2511: R1258.1 U250.6(FDIN)
N$2513: R1244.1 R1247.2 R1253.2
N$2514: R1259.2 U250.10(DOUT)
N$2515: R1260.2 U250.7(REXT)
N$2516: R1259.1 R1262.2 R1268.2
N$2517: C253.1 R1261.1 U251.9(VDD)
N$2518: LD757.K(C) U251.1(R)
N$2519: LD758.K(C) U251.2(G)
N$2520: LD759.K(C) U251.3(B)
N$2521: R1262.1 U251.8(DIN)
N$2522: R1263.1 U251.6(FDIN)
N$2523: R1264.2 U251.10(DOUT)
N$2524: R1265.2 U251.7(REXT)
N$2525: LD760.K(C) U252.1(R)
N$2526: LD761.K(C) U252.2(G)
N$2527: LD762.K(C) U252.3(B)
N$2528: C254.1 R1266.1 U252.9(VDD)
N$2529: R1267.1 U252.8(DIN)
N$2531: R1268.1 U252.6(FDIN)
N$2533: R1254.1 R1257.2 R1263.2
N$2534: R1269.2 U252.10(DOUT)
N$2535: R1270.2 U252.7(REXT)
N$2537: C255.1 R1271.1 U253.9(VDD)
N$2538: LD763.K(C) U253.1(R)
N$2539: LD764.K(C) U253.2(G)
N$2540: LD765.K(C) U253.3(B)
N$2541: R1272.1 U253.8(DIN)
N$2542: R1273.1 U253.6(FDIN)
N$2543: R1274.2 U253.10(DOUT)
N$2544: R1275.2 U253.7(REXT)
N$2545: LD766.K(C) U254.1(R)
N$2546: LD767.K(C) U254.2(G)
N$2547: LD768.K(C) U254.3(B)
N$2548: C256.1 R1276.1 U254.9(VDD)
N$2549: R1277.1 U254.8(DIN)
N$2551: R1278.1 U254.6(FDIN)
N$2554: R1279.2 U254.10(DOUT)
N$2555: R1280.2 U254.7(REXT)
N$2556: R1279.1 R1282.2 R1288.2
N$2557: C257.1 R1281.1 U255.9(VDD)
N$2558: LD769.K(C) U255.1(R)
N$2559: LD770.K(C) U255.2(G)
N$2560: LD771.K(C) U255.3(B)
N$2561: R1282.1 U255.8(DIN)
N$2562: R1283.1 U255.6(FDIN)
N$2563: R1284.2 U255.10(DOUT)
N$2564: R1285.2 U255.7(REXT)
N$2565: LD772.K(C) U256.1(R)
N$2566: LD773.K(C) U256.2(G)
N$2567: LD774.K(C) U256.3(B)
N$2568: C258.1 R1286.1 U256.9(VDD)
N$2569: R1287.1 U256.8(DIN)
N$2571: R1288.1 U256.6(FDIN)
N$2573: R1274.1 R1277.2 R1283.2
N$2574: R1289.2 U256.10(DOUT)
N$2575: R1290.2 U256.7(REXT)
N$2576: R1289.1 R1292.2 R1298.2
N$2577: C259.1 R1291.1 U257.9(VDD)
N$2578: LD775.K(C) U257.1(R)
N$2579: LD776.K(C) U257.2(G)
N$2580: LD777.K(C) U257.3(B)
N$2581: R1292.1 U257.8(DIN)
N$2582: R1293.1 U257.6(FDIN)
N$2583: R1294.2 U257.10(DOUT)
N$2584: R1295.2 U257.7(REXT)
N$2585: LD778.K(C) U258.1(R)
N$2586: LD779.K(C) U258.2(G)
N$2587: LD780.K(C) U258.3(B)
N$2588: C260.1 R1296.1 U258.9(VDD)
N$2589: R1297.1 U258.8(DIN)
N$2591: R1298.1 U258.6(FDIN)
N$2593: R1284.1 R1287.2 R1293.2
N$2594: R1299.2 U258.10(DOUT)
N$2595: R1300.2 U258.7(REXT)
N$2597: C261.1 R1301.1 U259.9(VDD)
N$2598: LD781.K(C) U259.1(R)
N$2599: LD782.K(C) U259.2(G)
N$2600: LD783.K(C) U259.3(B)
N$2601: R1302.1 U259.8(DIN)
N$2602: R1303.1 U259.6(FDIN)
N$2603: R1304.2 U259.10(DOUT)
N$2604: R1305.2 U259.7(REXT)
N$2605: LD784.K(C) U260.1(R)
N$2606: LD785.K(C) U260.2(G)
N$2607: LD786.K(C) U260.3(B)
N$2608: C262.1 R1306.1 U260.9(VDD)
N$2609: R1307.1 U260.8(DIN)
N$2611: R1308.1 U260.6(FDIN)
N$2614: R1309.2 U260.10(DOUT)
N$2615: R1310.2 U260.7(REXT)
N$2616: R1309.1 R1312.2 R1318.2
N$2617: C263.1 R1311.1 U261.9(VDD)
N$2618: LD787.K(C) U261.1(R)
N$2619: LD788.K(C) U261.2(G)
N$2620: LD789.K(C) U261.3(B)
N$2621: R1312.1 U261.8(DIN)
N$2622: R1313.1 U261.6(FDIN)
N$2623: R1314.2 U261.10(DOUT)
N$2624: R1315.2 U261.7(REXT)
N$2625: LD790.K(C) U262.1(R)
N$2626: LD791.K(C) U262.2(G)
N$2627: LD792.K(C) U262.3(B)
N$2628: C264.1 R1316.1 U262.9(VDD)
N$2629: R1317.1 U262.8(DIN)
N$2631: R1318.1 U262.6(FDIN)
N$2633: R1304.1 R1307.2 R1313.2
N$2634: R1319.2 U262.10(DOUT)
N$2635: R1320.2 U262.7(REXT)
N$2636: R1319.1 R1322.2 R1328.2
N$2637: C265.1 R1321.1 U263.9(VDD)
N$2638: LD793.K(C) U263.1(R)
N$2639: LD794.K(C) U263.2(G)
N$2640: LD795.K(C) U263.3(B)
N$2641: R1322.1 U263.8(DIN)
N$2642: R1323.1 U263.6(FDIN)
N$2643: R1324.2 U263.10(DOUT)
N$2644: R1325.2 U263.7(REXT)
N$2645: LD796.K(C) U264.1(R)
N$2646: LD797.K(C) U264.2(G)
N$2647: LD798.K(C) U264.3(B)
N$2648: C266.1 R1326.1 U264.9(VDD)
N$2649: R1327.1 U264.8(DIN)
N$2651: R1328.1 U264.6(FDIN)
N$2653: R1314.1 R1317.2 R1323.2
N$2654: R1329.2 U264.10(DOUT)
N$2655: R1330.2 U264.7(REXT)
Unconnected: U241.4(W) U242.4(W) U243.4(W) U244.4(W) U245.4(W) U246.4(W) U247.4(W) U248.4(W) U249.4(W) U250.4(W) U251.4(W) U252.4(W) U253.4(W) U254.4(W) U255.4(W) U256.4(W) U257.4(W) U258.4(W) U259.4(W) U260.4(W) U261.4(W) U262.4(W) U263.4(W) U264.4(W)

## Sheet 12 of 17: Row 12
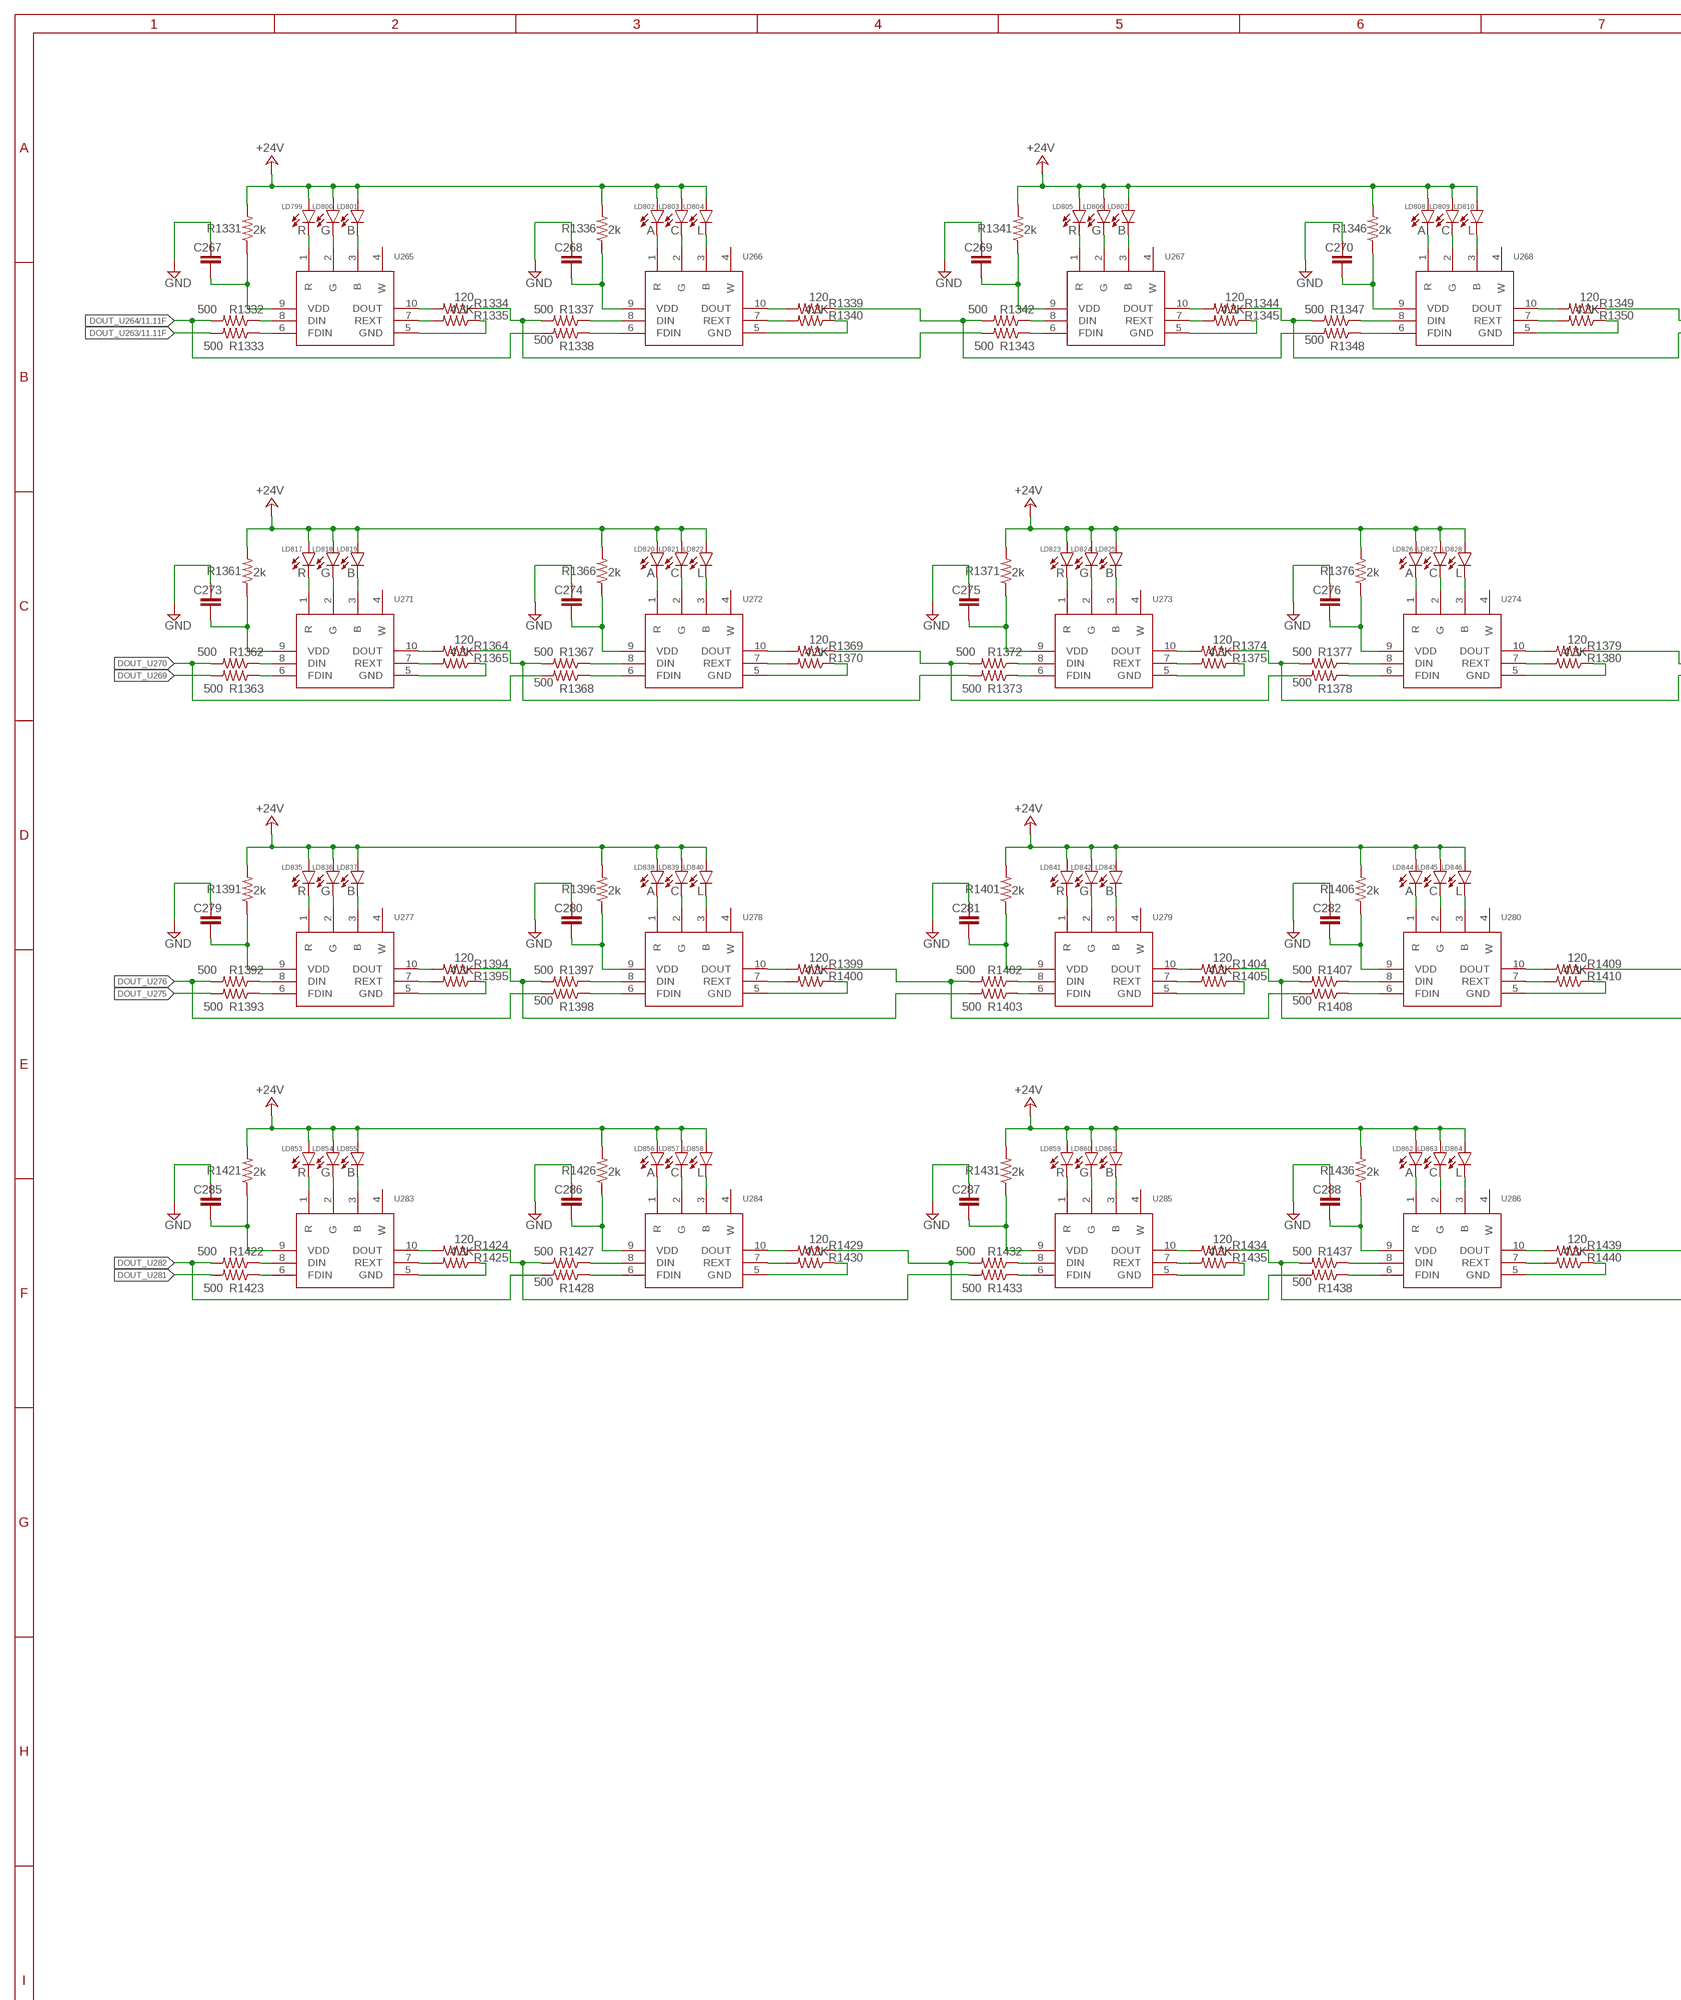
[diagram p22: schematic, sheet 12, part 1 of 2]
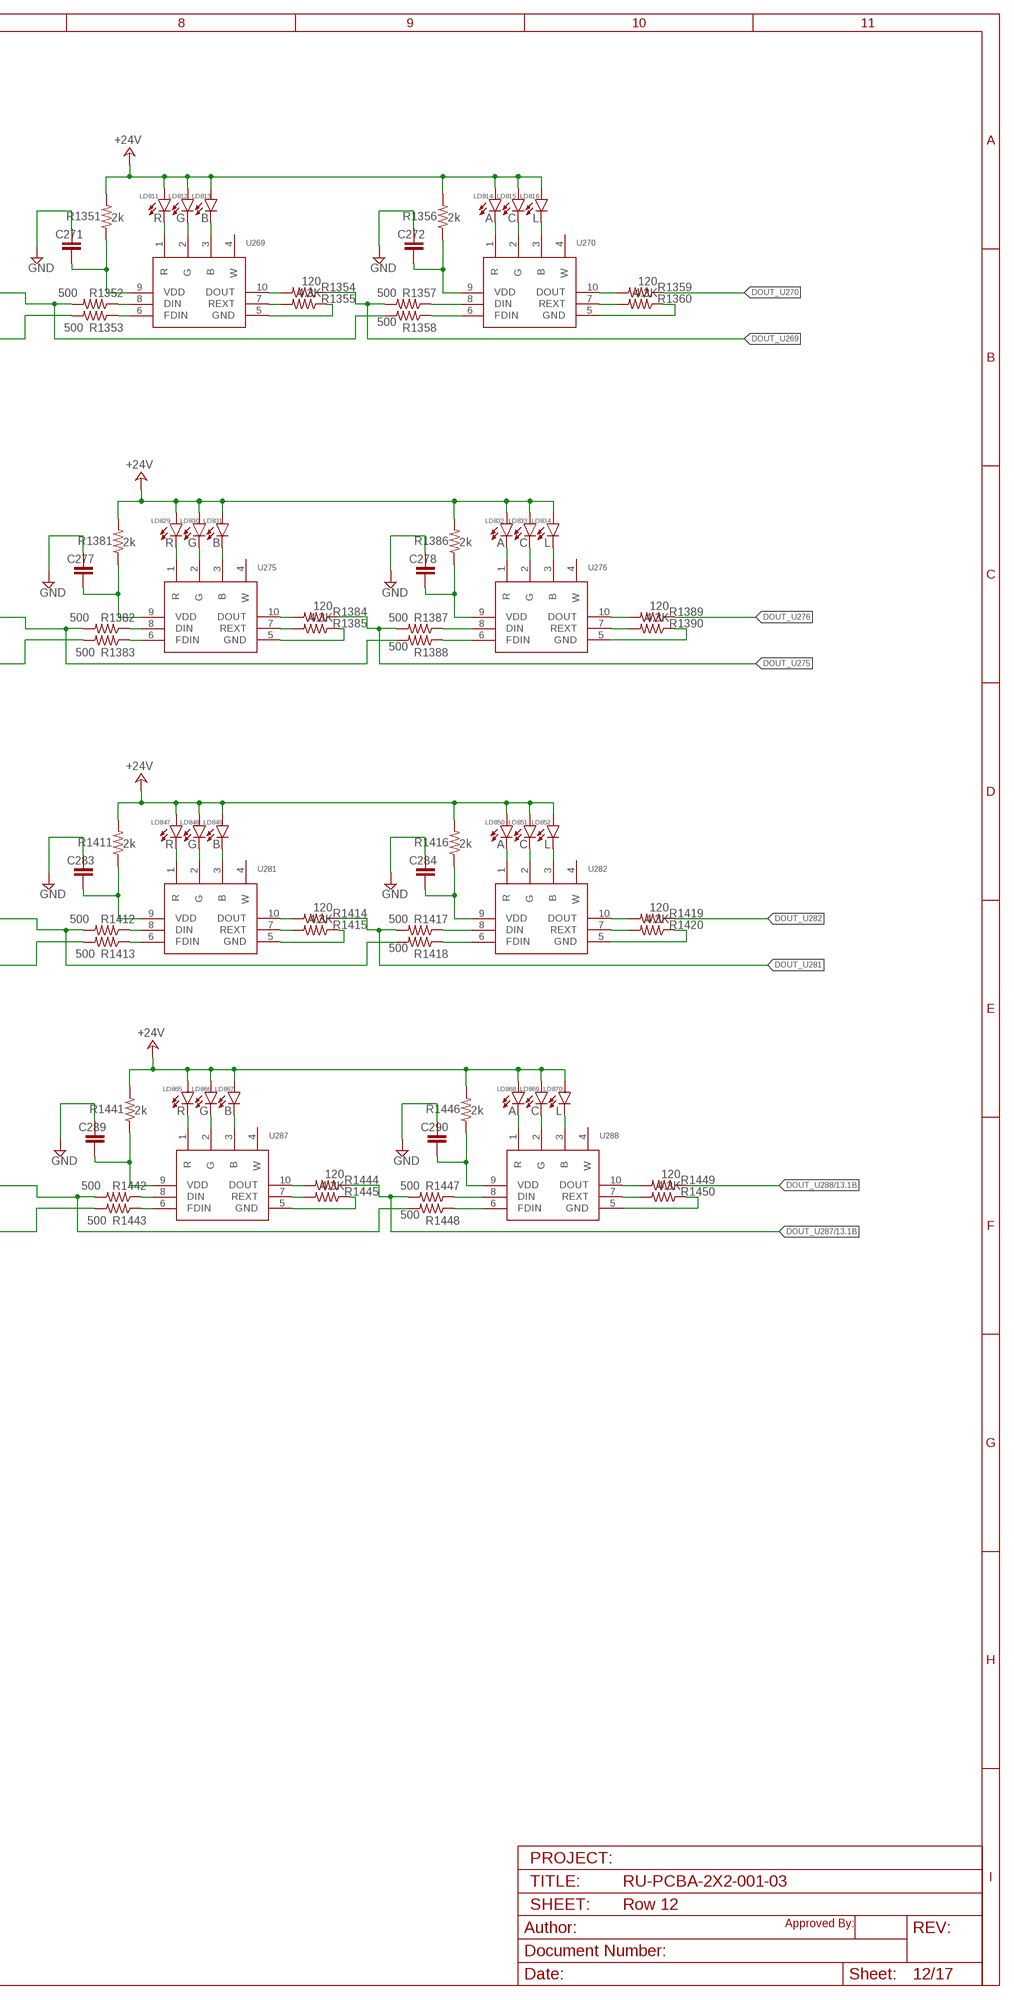
[diagram p23: schematic, sheet 12, part 2 of 2]

### Parts
C267  C-EUC1206  [C1206]
C268  C-EUC1206  [C1206]
C269  C-EUC1206  [C1206]
C270  C-EUC1206  [C1206]
C271  C-EUC1206  [C1206]
C272  C-EUC1206  [C1206]
C273  C-EUC1206  [C1206]
C274  C-EUC1206  [C1206]
C275  C-EUC1206  [C1206]
C276  C-EUC1206  [C1206]
C277  C-EUC1206  [C1206]
C278  C-EUC1206  [C1206]
C279  C-EUC1206  [C1206]
C280  C-EUC1206  [C1206]
C281  C-EUC1206  [C1206]
C282  C-EUC1206  [C1206]
C283  C-EUC1206  [C1206]
C284  C-EUC1206  [C1206]
C285  C-EUC1206  [C1206]
C286  C-EUC1206  [C1206]
C287  C-EUC1206  [C1206]
C288  C-EUC1206  [C1206]
C289  C-EUC1206  [C1206]
C290  C-EUC1206  [C1206]
LD799  R  5050LED  [5050LED]
LD800  G  5050LED  [5050LED]
LD801  B  5050LED  [5050LED]
LD802  A  5050LED  [5050LED]
LD803  C  5050LED  [5050LED]
LD804  L  5050LED  [5050LED]
LD805  R  5050LED  [5050LED]
LD806  G  5050LED  [5050LED]
LD807  B  5050LED  [5050LED]
LD808  A  5050LED  [5050LED]
LD809  C  5050LED  [5050LED]
LD810  L  5050LED  [5050LED]
LD811  R  5050LED  [5050LED]
LD812  G  5050LED  [5050LED]
LD813  B  5050LED  [5050LED]
LD814  A  5050LED  [5050LED]
LD815  C  5050LED  [5050LED]
LD816  L  5050LED  [5050LED]
LD817  R  5050LED  [5050LED]
LD818  G  5050LED  [5050LED]
LD819  B  5050LED  [5050LED]
LD820  A  5050LED  [5050LED]
LD821  C  5050LED  [5050LED]
LD822  L  5050LED  [5050LED]
LD823  R  5050LED  [5050LED]
LD824  G  5050LED  [5050LED]
LD825  B  5050LED  [5050LED]
LD826  A  5050LED  [5050LED]
LD827  C  5050LED  [5050LED]
LD828  L  5050LED  [5050LED]
LD829  R  5050LED  [5050LED]
LD830  G  5050LED  [5050LED]
LD831  B  5050LED  [5050LED]
LD832  A  5050LED  [5050LED]
LD833  C  5050LED  [5050LED]
LD834  L  5050LED  [5050LED]
LD835  R  5050LED  [5050LED]
LD836  G  5050LED  [5050LED]
LD837  B  5050LED  [5050LED]
LD838  A  5050LED  [5050LED]
LD839  C  5050LED  [5050LED]
LD840  L  5050LED  [5050LED]
LD841  R  5050LED  [5050LED]
LD842  G  5050LED  [5050LED]
LD843  B  5050LED  [5050LED]
LD844  A  5050LED  [5050LED]
LD845  C  5050LED  [5050LED]
LD846  L  5050LED  [5050LED]
LD847  R  5050LED  [5050LED]
LD848  G  5050LED  [5050LED]
LD849  B  5050LED  [5050LED]
LD850  A  5050LED  [5050LED]
LD851  C  5050LED  [5050LED]
LD852  L  5050LED  [5050LED]
LD853  R  5050LED  [5050LED]
LD854  G  5050LED  [5050LED]
LD855  B  5050LED  [5050LED]
LD856  A  5050LED  [5050LED]
LD857  C  5050LED  [5050LED]
LD858  L  5050LED  [5050LED]
LD859  R  5050LED  [5050LED]
LD860  G  5050LED  [5050LED]
LD861  B  5050LED  [5050LED]
LD862  A  5050LED  [5050LED]
LD863  C  5050LED  [5050LED]
LD864  L  5050LED  [5050LED]
LD865  R  5050LED  [5050LED]
LD866  G  5050LED  [5050LED]
LD867  B  5050LED  [5050LED]
LD868  A  5050LED  [5050LED]
LD869  C  5050LED  [5050LED]
LD870  L  5050LED  [5050LED]
R1331  2k  R-US_R1206  [R1206]
R1332  500  R-US_R0805  [R0805]
R1333  500  R-US_R0805  [R0805]
R1334  120  R-US_R0805  [R0805]
R1335  4.3K  R-US_R0805  [R0805]
R1336  2k  R-US_R1206  [R1206]
R1337  500  R-US_R0805  [R0805]
R1338  500  R-US_R0805  [R0805]
R1339  120  R-US_R0805  [R0805]
R1340  4.3K  R-US_R0805  [R0805]
R1341  2k  R-US_R1206  [R1206]
R1342  500  R-US_R0805  [R0805]
R1343  500  R-US_R0805  [R0805]
R1344  120  R-US_R0805  [R0805]
R1345  4.3K  R-US_R0805  [R0805]
R1346  2k  R-US_R1206  [R1206]
R1347  500  R-US_R0805  [R0805]
R1348  500  R-US_R0805  [R0805]
R1349  120  R-US_R0805  [R0805]
R1350  4.3K  R-US_R0805  [R0805]
R1351  2k  R-US_R1206  [R1206]
R1352  500  R-US_R0805  [R0805]
R1353  500  R-US_R0805  [R0805]
R1354  120  R-US_R0805  [R0805]
R1355  4.3K  R-US_R0805  [R0805]
R1356  2k  R-US_R1206  [R1206]
R1357  500  R-US_R0805  [R0805]
R1358  500  R-US_R0805  [R0805]
R1359  120  R-US_R0805  [R0805]
R1360  4.3K  R-US_R0805  [R0805]
R1361  2k  R-US_R1206  [R1206]
R1362  500  R-US_R0805  [R0805]
R1363  500  R-US_R0805  [R0805]
R1364  120  R-US_R0805  [R0805]
R1365  4.3K  R-US_R0805  [R0805]
R1366  2k  R-US_R1206  [R1206]
R1367  500  R-US_R0805  [R0805]
R1368  500  R-US_R0805  [R0805]
R1369  120  R-US_R0805  [R0805]
R1370  4.3K  R-US_R0805  [R0805]
R1371  2k  R-US_R1206  [R1206]
R1372  500  R-US_R0805  [R0805]
R1373  500  R-US_R0805  [R0805]
R1374  120  R-US_R0805  [R0805]
R1375  4.3K  R-US_R0805  [R0805]
R1376  2k  R-US_R1206  [R1206]
R1377  500  R-US_R0805  [R0805]
R1378  500  R-US_R0805  [R0805]
R1379  120  R-US_R0805  [R0805]
R1380  4.3K  R-US_R0805  [R0805]
R1381  2k  R-US_R1206  [R1206]
R1382  500  R-US_R0805  [R0805]
R1383  500  R-US_R0805  [R0805]
R1384  120  R-US_R0805  [R0805]
R1385  4.3K  R-US_R0805  [R0805]
R1386  2k  R-US_R1206  [R1206]
R1387  500  R-US_R0805  [R0805]
R1388  500  R-US_R0805  [R0805]
R1389  120  R-US_R0805  [R0805]
R1390  4.3K  R-US_R0805  [R0805]
R1391  2k  R-US_R1206  [R1206]
R1392  500  R-US_R0805  [R0805]
R1393  500  R-US_R0805  [R0805]
R1394  120  R-US_R0805  [R0805]
R1395  4.3K  R-US_R0805  [R0805]
R1396  2k  R-US_R1206  [R1206]
R1397  500  R-US_R0805  [R0805]
R1398  500  R-US_R0805  [R0805]
R1399  120  R-US_R0805  [R0805]
R1400  4.3K  R-US_R0805  [R0805]
R1401  2k  R-US_R1206  [R1206]
R1402  500  R-US_R0805  [R0805]
R1403  500  R-US_R0805  [R0805]
R1404  120  R-US_R0805  [R0805]
R1405  4.3K  R-US_R0805  [R0805]
R1406  2k  R-US_R1206  [R1206]
R1407  500  R-US_R0805  [R0805]
R1408  500  R-US_R0805  [R0805]
R1409  120  R-US_R0805  [R0805]
R1410  4.3K  R-US_R0805  [R0805]
R1411  2k  R-US_R1206  [R1206]
R1412  500  R-US_R0805  [R0805]
R1413  500  R-US_R0805  [R0805]
R1414  120  R-US_R0805  [R0805]
R1415  4.3K  R-US_R0805  [R0805]
R1416  2k  R-US_R1206  [R1206]
R1417  500  R-US_R0805  [R0805]
R1418  500  R-US_R0805  [R0805]
R1419  120  R-US_R0805  [R0805]
R1420  4.3K  R-US_R0805  [R0805]
R1421  2k  R-US_R1206  [R1206]
R1422  500  R-US_R0805  [R0805]
R1423  500  R-US_R0805  [R0805]
R1424  120  R-US_R0805  [R0805]
R1425  4.3K  R-US_R0805  [R0805]
R1426  2k  R-US_R1206  [R1206]
R1427  500  R-US_R0805  [R0805]
R1428  500  R-US_R0805  [R0805]
R1429  120  R-US_R0805  [R0805]
R1430  4.3K  R-US_R0805  [R0805]
R1431  2k  R-US_R1206  [R1206]
R1432  500  R-US_R0805  [R0805]
R1433  500  R-US_R0805  [R0805]
R1434  120  R-US_R0805  [R0805]
R1435  4.3K  R-US_R0805  [R0805]
R1436  2k  R-US_R1206  [R1206]
R1437  500  R-US_R0805  [R0805]
R1438  500  R-US_R0805  [R0805]
R1439  120  R-US_R0805  [R0805]
R1440  4.3K  R-US_R0805  [R0805]
R1441  2k  R-US_R1206  [R1206]
R1442  500  R-US_R0805  [R0805]
R1443  500  R-US_R0805  [R0805]
R1444  120  R-US_R0805  [R0805]
R1445  4.3K  R-US_R0805  [R0805]
R1446  2k  R-US_R1206  [R1206]
R1447  500  R-US_R0805  [R0805]
R1448  500  R-US_R0805  [R0805]
R1449  120  R-US_R0805  [R0805]
R1450  4.3K  R-US_R0805  [R0805]
U265  UCS7604  [SOP100P600X175-10N]
U266  UCS7604  [SOP100P600X175-10N]
U267  UCS7604  [SOP100P600X175-10N]
U268  UCS7604  [SOP100P600X175-10N]
U269  UCS7604  [SOP100P600X175-10N]
U270  UCS7604  [SOP100P600X175-10N]
U271  UCS7604  [SOP100P600X175-10N]
U272  UCS7604  [SOP100P600X175-10N]
U273  UCS7604  [SOP100P600X175-10N]
U274  UCS7604  [SOP100P600X175-10N]
U275  UCS7604  [SOP100P600X175-10N]
U276  UCS7604  [SOP100P600X175-10N]
U277  UCS7604  [SOP100P600X175-10N]
U278  UCS7604  [SOP100P600X175-10N]
U279  UCS7604  [SOP100P600X175-10N]
U280  UCS7604  [SOP100P600X175-10N]
U281  UCS7604  [SOP100P600X175-10N]
U282  UCS7604  [SOP100P600X175-10N]
U283  UCS7604  [SOP100P600X175-10N]
U284  UCS7604  [SOP100P600X175-10N]
U285  UCS7604  [SOP100P600X175-10N]
U286  UCS7604  [SOP100P600X175-10N]
U287  UCS7604  [SOP100P600X175-10N]
U288  UCS7604  [SOP100P600X175-10N]

### Nets
+24V: LD799.A LD800.A LD801.A LD802.A LD803.A LD804.A LD805.A LD806.A LD807.A LD808.A LD809.A LD810.A LD811.A LD812.A LD813.A LD814.A LD815.A LD816.A LD817.A LD818.A LD819.A LD820.A LD821.A LD822.A LD823.A LD824.A LD825.A LD826.A LD827.A LD828.A LD829.A LD830.A LD831.A LD832.A LD833.A LD834.A LD835.A LD836.A LD837.A LD838.A LD839.A LD840.A LD841.A LD842.A LD843.A LD844.A LD845.A LD846.A LD847.A LD848.A LD849.A LD850.A LD851.A LD852.A LD853.A LD854.A LD855.A LD856.A LD857.A LD858.A LD859.A LD860.A LD861.A LD862.A LD863.A LD864.A LD865.A LD866.A LD867.A LD868.A LD869.A LD870.A R1331.2 R1336.2 R1341.2 R1346.2 R1351.2 R1356.2 R1361.2 R1366.2 R1371.2 R1376.2 R1381.2 R1386.2 R1391.2 R1396.2 R1401.2 R1406.2 R1411.2 R1416.2 R1421.2 R1426.2 R1431.2 R1436.2 R1441.2 R1446.2 ; also sheet 1,2,3,4,5,6,7,8,9,10,11,13,14
DOUT_U263: R1333.2 ; also sheet 11
DOUT_U264: R1332.2 R1338.2 ; also sheet 11
DOUT_U269: R1354.1 R1357.2 R1363.2
DOUT_U270: R1359.1 R1362.2 R1368.2
DOUT_U275: R1384.1 R1387.2 R1393.2
DOUT_U276: R1389.1 R1392.2 R1398.2
DOUT_U281: R1414.1 R1417.2 R1423.2
DOUT_U282: R1419.1 R1422.2 R1428.2
DOUT_U287: R1444.1 R1447.2 ; also sheet 13
DOUT_U288: R1449.1 ; also sheet 13
GND: C267.2 C268.2 C269.2 C270.2 C271.2 C272.2 C273.2 C274.2 C275.2 C276.2 C277.2 C278.2 C279.2 C280.2 C281.2 C282.2 C283.2 C284.2 C285.2 C286.2 C287.2 C288.2 C289.2 C290.2 R1335.1 R1340.1 R1345.1 R1350.1 R1355.1 R1360.1 R1365.1 R1370.1 R1375.1 R1380.1 R1385.1 R1390.1 R1395.1 R1400.1 R1405.1 R1410.1 R1415.1 R1420.1 R1425.1 R1430.1 R1435.1 R1440.1 R1445.1 R1450.1 U265.5(GND) U266.5(GND) U267.5(GND) U268.5(GND) U269.5(GND) U270.5(GND) U271.5(GND) U272.5(GND) U273.5(GND) U274.5(GND) U275.5(GND) U276.5(GND) U277.5(GND) U278.5(GND) U279.5(GND) U280.5(GND) U281.5(GND) U282.5(GND) U283.5(GND) U284.5(GND) U285.5(GND) U286.5(GND) U287.5(GND) U288.5(GND) ; also sheet 1,2,3,4,5,6,7,8,9,10,11,13,14
N$2657: C267.1 R1331.1 U265.9(VDD)
N$2658: LD799.K(C) U265.1(R)
N$2659: LD800.K(C) U265.2(G)
N$2660: LD801.K(C) U265.3(B)
N$2661: R1332.1 U265.8(DIN)
N$2662: R1333.1 U265.6(FDIN)
N$2663: R1334.2 U265.10(DOUT)
N$2664: R1335.2 U265.7(REXT)
N$2665: LD802.K(C) U266.1(R)
N$2666: LD803.K(C) U266.2(G)
N$2667: LD804.K(C) U266.3(B)
N$2668: C268.1 R1336.1 U266.9(VDD)
N$2669: R1337.1 U266.8(DIN)
N$2671: R1338.1 U266.6(FDIN)
N$2674: R1339.2 U266.10(DOUT)
N$2675: R1340.2 U266.7(REXT)
N$2676: R1339.1 R1342.2 R1348.2
N$2677: C269.1 R1341.1 U267.9(VDD)
N$2678: LD805.K(C) U267.1(R)
N$2679: LD806.K(C) U267.2(G)
N$2680: LD807.K(C) U267.3(B)
N$2681: R1342.1 U267.8(DIN)
N$2682: R1343.1 U267.6(FDIN)
N$2683: R1344.2 U267.10(DOUT)
N$2684: R1345.2 U267.7(REXT)
N$2685: LD808.K(C) U268.1(R)
N$2686: LD809.K(C) U268.2(G)
N$2687: LD810.K(C) U268.3(B)
N$2688: C270.1 R1346.1 U268.9(VDD)
N$2689: R1347.1 U268.8(DIN)
N$2690: R1344.1 R1347.2 R1353.2
N$2691: R1348.1 U268.6(FDIN)
N$2693: R1334.1 R1337.2 R1343.2
N$2694: R1349.2 U268.10(DOUT)
N$2695: R1350.2 U268.7(REXT)
N$2696: R1349.1 R1352.2 R1358.2
N$2697: C271.1 R1351.1 U269.9(VDD)
N$2698: LD811.K(C) U269.1(R)
N$2699: LD812.K(C) U269.2(G)
N$2700: LD813.K(C) U269.3(B)
N$2701: R1352.1 U269.8(DIN)
N$2702: R1353.1 U269.6(FDIN)
N$2703: R1354.2 U269.10(DOUT)
N$2704: R1355.2 U269.7(REXT)
N$2705: LD814.K(C) U270.1(R)
N$2706: LD815.K(C) U270.2(G)
N$2707: LD816.K(C) U270.3(B)
N$2708: C272.1 R1356.1 U270.9(VDD)
N$2709: R1357.1 U270.8(DIN)
N$2711: R1358.1 U270.6(FDIN)
N$2714: R1359.2 U270.10(DOUT)
N$2715: R1360.2 U270.7(REXT)
N$2717: C273.1 R1361.1 U271.9(VDD)
N$2718: LD817.K(C) U271.1(R)
N$2719: LD818.K(C) U271.2(G)
N$2720: LD819.K(C) U271.3(B)
N$2721: R1362.1 U271.8(DIN)
N$2722: R1363.1 U271.6(FDIN)
N$2723: R1364.2 U271.10(DOUT)
N$2724: R1365.2 U271.7(REXT)
N$2725: LD820.K(C) U272.1(R)
N$2726: LD821.K(C) U272.2(G)
N$2727: LD822.K(C) U272.3(B)
N$2728: C274.1 R1366.1 U272.9(VDD)
N$2729: R1367.1 U272.8(DIN)
N$2730: R1364.1 R1367.2 R1373.2
N$2731: R1368.1 U272.6(FDIN)
N$2734: R1369.2 U272.10(DOUT)
N$2735: R1370.2 U272.7(REXT)
N$2736: R1369.1 R1372.2 R1378.2
N$2737: C275.1 R1371.1 U273.9(VDD)
N$2738: LD823.K(C) U273.1(R)
N$2739: LD824.K(C) U273.2(G)
N$2740: LD825.K(C) U273.3(B)
N$2741: R1372.1 U273.8(DIN)
N$2742: R1373.1 U273.6(FDIN)
N$2743: R1374.2 U273.10(DOUT)
N$2744: R1375.2 U273.7(REXT)
N$2745: LD826.K(C) U274.1(R)
N$2746: LD827.K(C) U274.2(G)
N$2747: LD828.K(C) U274.3(B)
N$2748: C276.1 R1376.1 U274.9(VDD)
N$2749: R1377.1 U274.8(DIN)
N$2750: R1374.1 R1377.2 R1383.2
N$2751: R1378.1 U274.6(FDIN)
N$2754: R1379.2 U274.10(DOUT)
N$2755: R1380.2 U274.7(REXT)
N$2756: R1379.1 R1382.2 R1388.2
N$2757: C277.1 R1381.1 U275.9(VDD)
N$2758: LD829.K(C) U275.1(R)
N$2759: LD830.K(C) U275.2(G)
N$2760: LD831.K(C) U275.3(B)
N$2761: R1382.1 U275.8(DIN)
N$2762: R1383.1 U275.6(FDIN)
N$2763: R1384.2 U275.10(DOUT)
N$2764: R1385.2 U275.7(REXT)
N$2765: LD832.K(C) U276.1(R)
N$2766: LD833.K(C) U276.2(G)
N$2767: LD834.K(C) U276.3(B)
N$2768: C278.1 R1386.1 U276.9(VDD)
N$2769: R1387.1 U276.8(DIN)
N$2771: R1388.1 U276.6(FDIN)
N$2774: R1389.2 U276.10(DOUT)
N$2775: R1390.2 U276.7(REXT)
N$2777: C279.1 R1391.1 U277.9(VDD)
N$2778: LD835.K(C) U277.1(R)
N$2779: LD836.K(C) U277.2(G)
N$2780: LD837.K(C) U277.3(B)
N$2781: R1392.1 U277.8(DIN)
N$2782: R1393.1 U277.6(FDIN)
N$2783: R1394.2 U277.10(DOUT)
N$2784: R1395.2 U277.7(REXT)
N$2785: LD838.K(C) U278.1(R)
N$2786: LD839.K(C) U278.2(G)
N$2787: LD840.K(C) U278.3(B)
N$2788: C280.1 R1396.1 U278.9(VDD)
N$2789: R1397.1 U278.8(DIN)
N$2790: R1394.1 R1397.2 R1403.2
N$2791: R1398.1 U278.6(FDIN)
N$2794: R1399.2 U278.10(DOUT)
N$2795: R1400.2 U278.7(REXT)
N$2797: C281.1 R1401.1 U279.9(VDD)
N$2798: LD841.K(C) U279.1(R)
N$2799: LD842.K(C) U279.2(G)
N$2800: LD843.K(C) U279.3(B)
N$2801: R1402.1 U279.8(DIN)
N$2802: R1403.1 U279.6(FDIN)
N$2803: R1404.2 U279.10(DOUT)
N$2804: R1405.2 U279.7(REXT)
N$2805: LD844.K(C) U280.1(R)
N$2806: LD845.K(C) U280.2(G)
N$2807: LD846.K(C) U280.3(B)
N$2808: C282.1 R1406.1 U280.9(VDD)
N$2809: R1407.1 U280.8(DIN)
N$2810: R1404.1 R1407.2 R1413.2
N$2811: R1408.1 U280.6(FDIN)
N$2812: R1399.1 R1402.2 R1408.2
N$2814: R1409.2 U280.10(DOUT)
N$2815: R1410.2 U280.7(REXT)
N$2816: R1409.1 R1412.2 R1418.2
N$2817: C283.1 R1411.1 U281.9(VDD)
N$2818: LD847.K(C) U281.1(R)
N$2819: LD848.K(C) U281.2(G)
N$2820: LD849.K(C) U281.3(B)
N$2821: R1412.1 U281.8(DIN)
N$2822: R1413.1 U281.6(FDIN)
N$2823: R1414.2 U281.10(DOUT)
N$2824: R1415.2 U281.7(REXT)
N$2825: LD850.K(C) U282.1(R)
N$2826: LD851.K(C) U282.2(G)
N$2827: LD852.K(C) U282.3(B)
N$2828: C284.1 R1416.1 U282.9(VDD)
N$2829: R1417.1 U282.8(DIN)
N$2831: R1418.1 U282.6(FDIN)
N$2834: R1419.2 U282.10(DOUT)
N$2835: R1420.2 U282.7(REXT)
N$2837: C285.1 R1421.1 U283.9(VDD)
N$2838: LD853.K(C) U283.1(R)
N$2839: LD854.K(C) U283.2(G)
N$2840: LD855.K(C) U283.3(B)
N$2841: R1422.1 U283.8(DIN)
N$2842: R1423.1 U283.6(FDIN)
N$2843: R1424.2 U283.10(DOUT)
N$2844: R1425.2 U283.7(REXT)
N$2845: LD856.K(C) U284.1(R)
N$2846: LD857.K(C) U284.2(G)
N$2847: LD858.K(C) U284.3(B)
N$2848: C286.1 R1426.1 U284.9(VDD)
N$2849: R1427.1 U284.8(DIN)
N$2850: R1424.1 R1427.2 R1433.2
N$2851: R1428.1 U284.6(FDIN)
N$2854: R1429.2 U284.10(DOUT)
N$2855: R1430.2 U284.7(REXT)
N$2856: R1429.1 R1432.2 R1438.2
N$2857: C287.1 R1431.1 U285.9(VDD)
N$2858: LD859.K(C) U285.1(R)
N$2859: LD860.K(C) U285.2(G)
N$2860: LD861.K(C) U285.3(B)
N$2861: R1432.1 U285.8(DIN)
N$2862: R1433.1 U285.6(FDIN)
N$2863: R1434.2 U285.10(DOUT)
N$2864: R1435.2 U285.7(REXT)
N$2865: LD862.K(C) U286.1(R)
N$2866: LD863.K(C) U286.2(G)
N$2867: LD864.K(C) U286.3(B)
N$2868: C288.1 R1436.1 U286.9(VDD)
N$2869: R1437.1 U286.8(DIN)
N$2870: R1434.1 R1437.2 R1443.2
N$2871: R1438.1 U286.6(FDIN)
N$2874: R1439.2 U286.10(DOUT)
N$2875: R1440.2 U286.7(REXT)
N$2876: R1439.1 R1442.2 R1448.2
N$2877: C289.1 R1441.1 U287.9(VDD)
N$2878: LD865.K(C) U287.1(R)
N$2879: LD866.K(C) U287.2(G)
N$2880: LD867.K(C) U287.3(B)
N$2881: R1442.1 U287.8(DIN)
N$2882: R1443.1 U287.6(FDIN)
N$2883: R1444.2 U287.10(DOUT)
N$2884: R1445.2 U287.7(REXT)
N$2885: LD868.K(C) U288.1(R)
N$2886: LD869.K(C) U288.2(G)
N$2887: LD870.K(C) U288.3(B)
N$2888: C290.1 R1446.1 U288.9(VDD)
N$2889: R1447.1 U288.8(DIN)
N$2891: R1448.1 U288.6(FDIN)
N$2894: R1449.2 U288.10(DOUT)
N$2895: R1450.2 U288.7(REXT)
Unconnected: U265.4(W) U266.4(W) U267.4(W) U268.4(W) U269.4(W) U270.4(W) U271.4(W) U272.4(W) U273.4(W) U274.4(W) U275.4(W) U276.4(W) U277.4(W) U278.4(W) U279.4(W) U280.4(W) U281.4(W) U282.4(W) U283.4(W) U284.4(W) U285.4(W) U286.4(W) U287.4(W) U288.4(W)